# EAGLE schematic powermodule (EAGLE 9.6.2)
SCHEMATIC_VERSION: V6.2.2

## Sheet 1 of 11: SPI-Flash
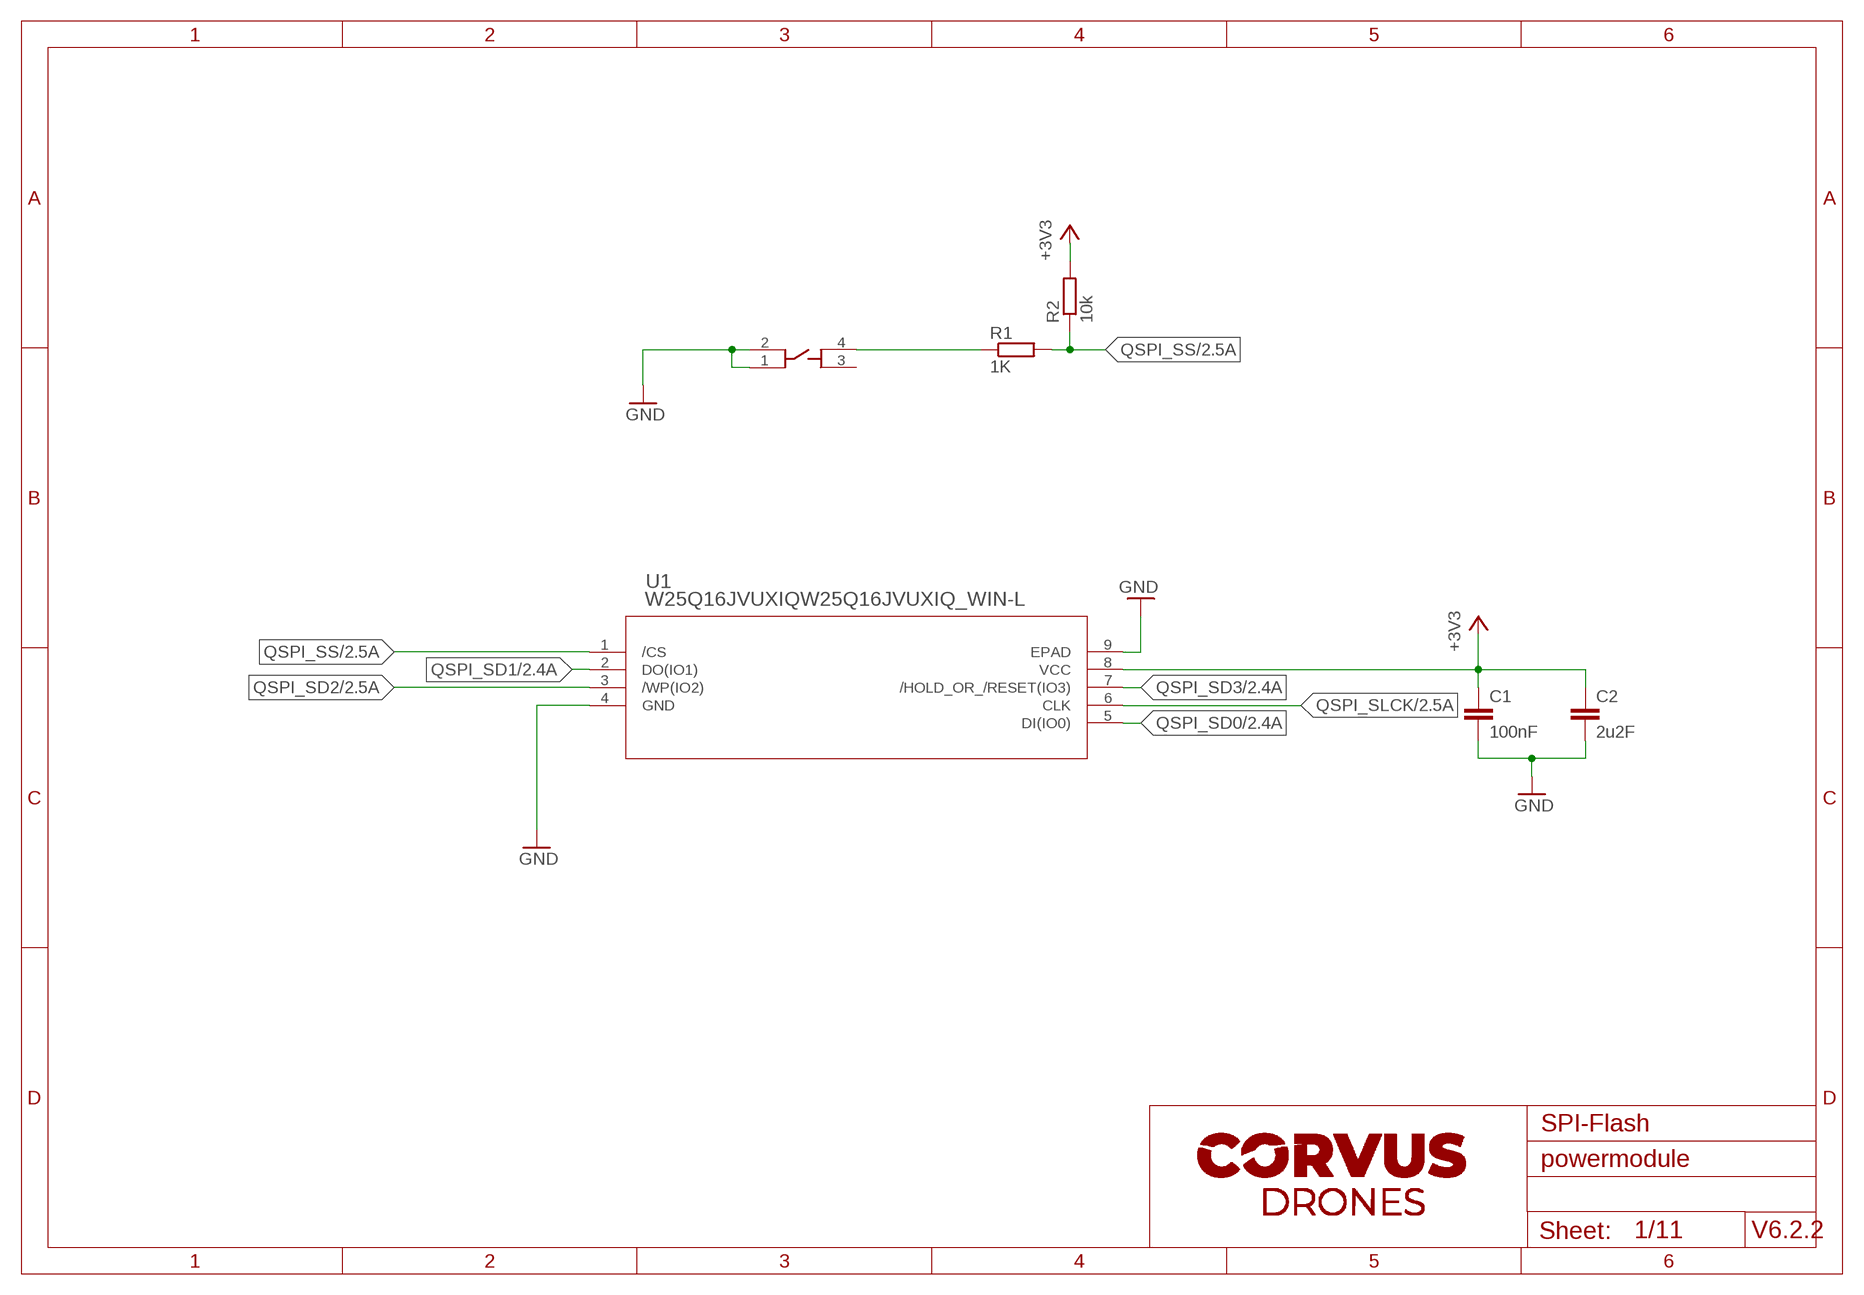
[diagram p0: schematic, sheet 1]

### Parts
C1  100nF  C_0603_100N  [C0603]
C2  2u2F  C_0603_2U2  [C0603]
R1  1K  R_0603_1K  [R0603]
R2  10k  R_0603_10K  [R0603]
SW1  BOOTSEL  EVQ-P7J01P  [EVQ-P7J01P]
U1  W25Q16JVUXIQW25Q16JVUXIQ_WIN-L  [W25Q16JVUXIQ_WIN-L]

### Nets
+3V3: C1.1 C2.1 R2.2 U1.8(VCC) ; also sheet 2,4,6,7,10
GND: C1.2 C2.2 SW1.1 SW1.2 U1.4(GND) U1.9(EPAD) ; also sheet 2,3,4,5,6,7,8,9,10,11
N$1: R1.1 SW1.4
QSPI_SD0: U1.5(DI(IO0)) ; also sheet 2
QSPI_SD1: U1.2(DO(IO1)) ; also sheet 2
QSPI_SD2: U1.3(/WP(IO2)) ; also sheet 2
QSPI_SD3: U1.7(/HOLD_OR_/RESET(IO3)) ; also sheet 2
QSPI_SLCK: U1.6(CLK) ; also sheet 2
QSPI_SS: R1.2 R2.1 U1.1(/CS) ; also sheet 2
Unconnected: SW1.3

## Sheet 2 of 11: RP2040 mCU part
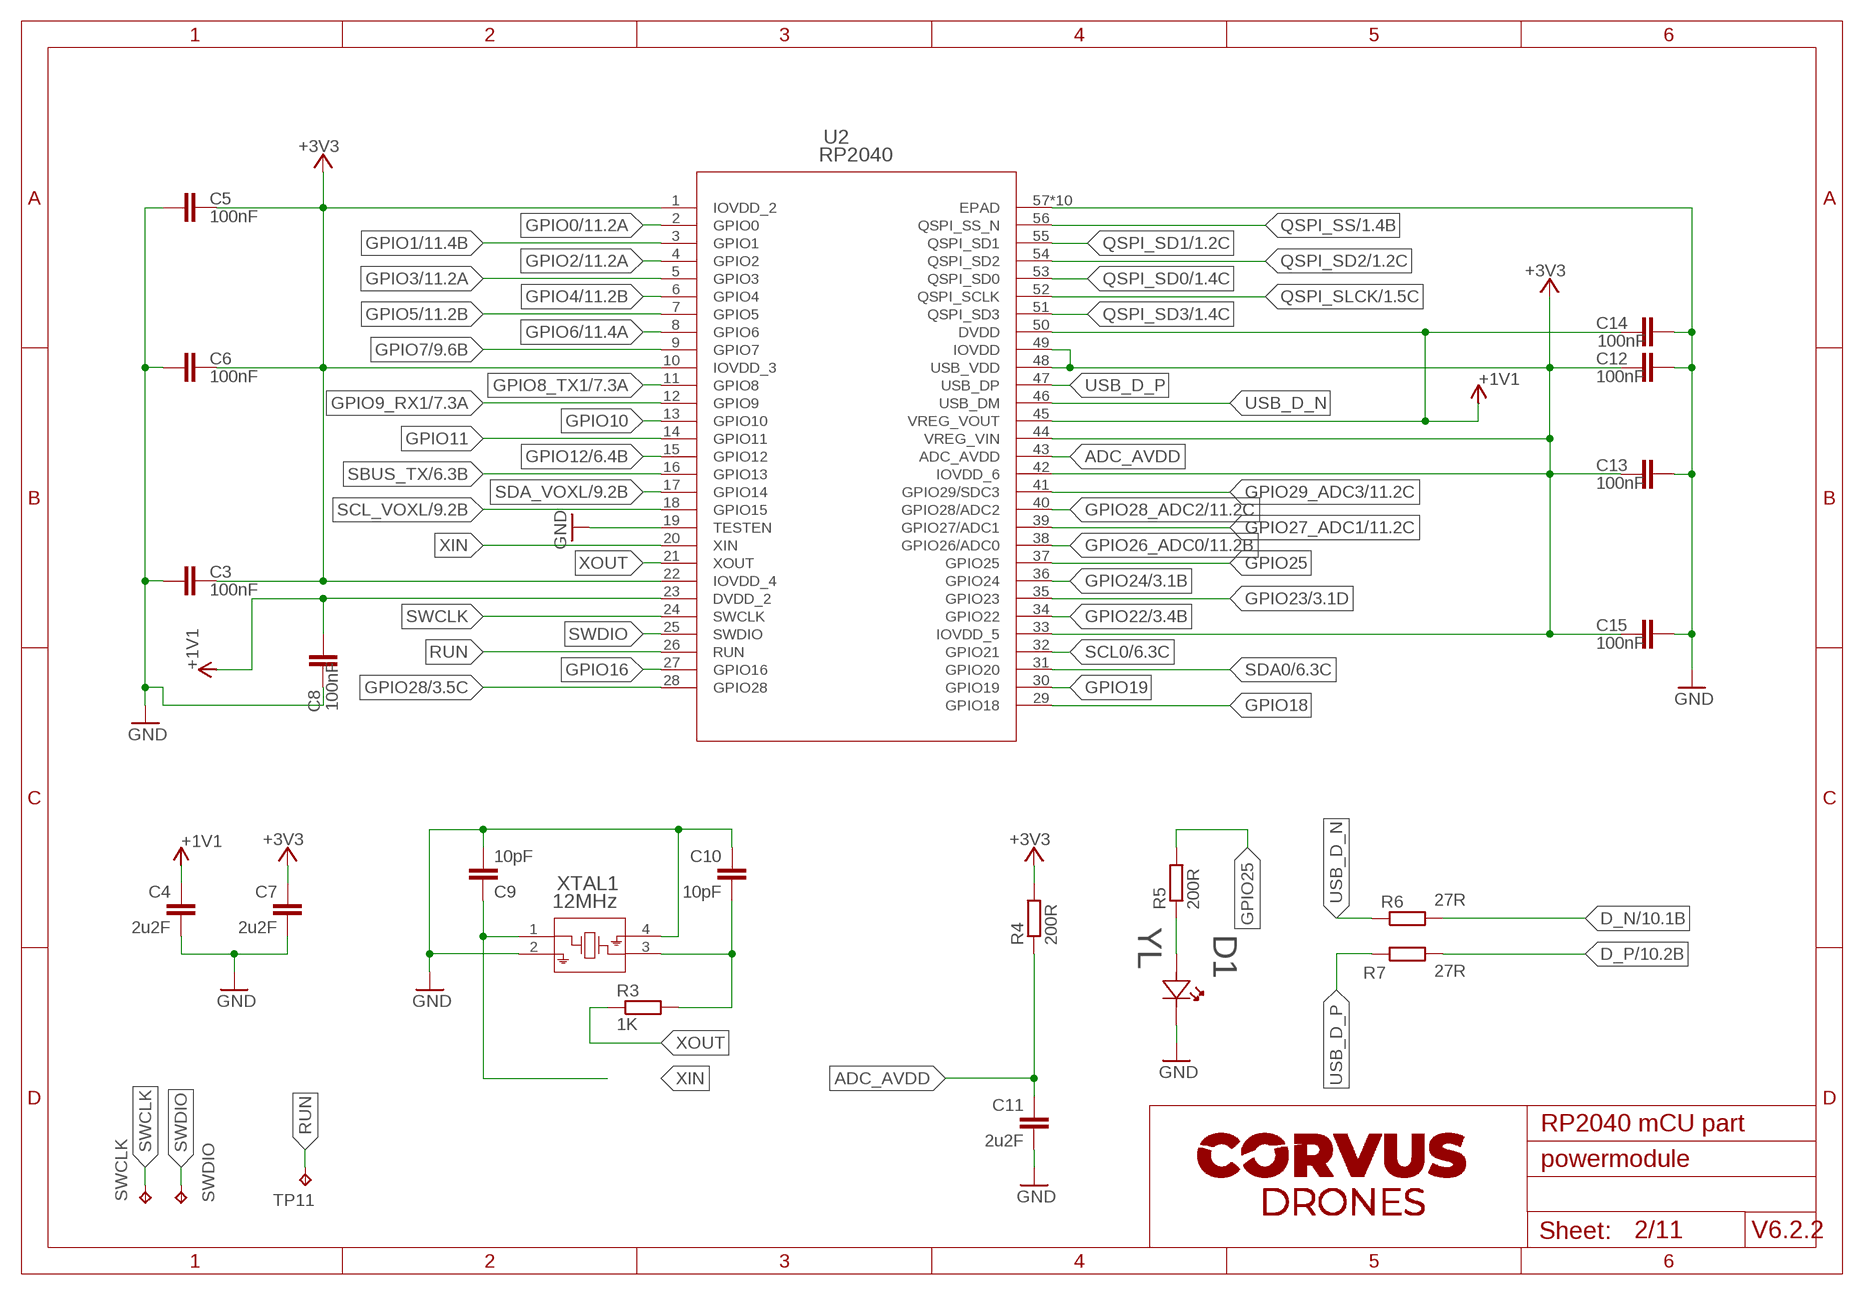
[diagram p1: schematic, sheet 2]

### Parts
C3  100nF  C_0603_100N  [C0603]
C4  2u2F  C_0603_2U2  [C0603]
C5  100nF  C_0603_100N  [C0603]
C6  100nF  C_0603_100N  [C0603]
C7  2u2F  C_0603_2U2  [C0603]
C8  100nF  C_0603_100N  [C0603]
C9  10pF  C_0603_10P  [C0603]
C10  10pF  C_0603_10P  [C0603]
C11  2u2F  C_0603_2U2  [C0603]
C12  100nF  C_0603_100N  [C0603]
C13  100nF  C_0603_100N  [C0603]
C14  100nF  C_0603_100N  [C0603]
C15  100nF  C_0603_100N  [C0603]
D1  YL  LED_0805_YELLOW  [LED_0805]
R3  1K  R_0603_1K  [R0603]
R4  200R  R_0603_200R  [R0603]
R5  200R  R_0603_200R  [R0603]
R6  27R  R_0603_27R  [R0603]
R7  27R  R_0603_27R  [R0603]
SWCLK  TPTP11R  [TP11R]
SWDIO  TPTP11R  [TP11R]
TP11  TPTP11R  [TP11R]
U2  RP2040  RP2040TR7_RPI-L  [RP2040TR7_RPI-L]
XTAL1  12MHz  MCSJK-7U-12.00-10-10-80-B-10_12MHZSMD3225_3.2X2.5X0.7_MTC-L  [SMD3225_3.2X2.5X0.7_MTC-L]

### Nets
+1V1: C4.2 C8.1 C14.2 U2.23(DVDD_2) U2.45(VREG_VOUT) U2.50(DVDD) ; supply symbol labelled 1V1
+3V3: C3.2 C5.1 C6.1 C7.2 C12.1 C13.1 C15.2 R4.2 U2.1(IOVDD_2) U2.10(IOVDD_3) U2.22(IOVDD_4) U2.33(IOVDD_5) U2.42(IOVDD_6) U2.44(VREG_VIN) U2.48(USB_VDD) U2.49(IOVDD) ; also sheet 1,4,6,7,10
ADC_AVDD: C11.2 R4.1 U2.43(ADC_AVDD)
D_N [dif pairs]: R6.2 ; also sheet 10
D_P [dif pairs]: R7.2 ; also sheet 10
GND: C3.1 C4.1 C5.2 C6.2 C7.1 C8.2 C9.1 C10.2 C11.1 C12.2 C13.2 C14.1 C15.1 D1.C U2.19(TESTEN) U2.57(EPAD) U2.58(EPAD) U2.59(EPAD) U2.60(EPAD) U2.61(EPAD) U2.62(EPAD) U2.63(EPAD) U2.64(EPAD) U2.65(EPAD) U2.66(EPAD) XTAL1.2 XTAL1.4 ; also sheet 1,3,4,5,6,7,8,9,10,11
GPIO0: U2.2(GPIO0) ; also sheet 11
GPIO1: U2.3(GPIO1) ; also sheet 11
GPIO2: U2.4(GPIO2) ; also sheet 11
GPIO3: U2.5(GPIO3) ; also sheet 11
GPIO4: U2.6(GPIO4) ; also sheet 11
GPIO5: U2.7(GPIO5) ; also sheet 11
GPIO6: U2.8(GPIO6) ; also sheet 11
GPIO7: U2.9(GPIO7) ; also sheet 9
GPIO8_TX1: U2.11(GPIO8) ; also sheet 7
GPIO9_RX1: U2.12(GPIO9) ; also sheet 7
GPIO10: U2.13(GPIO10)
GPIO11: U2.14(GPIO11)
GPIO12: U2.15(GPIO12) ; also sheet 6
GPIO16: U2.27(GPIO16)
GPIO18: U2.29(GPIO18)
GPIO19: U2.30(GPIO19)
GPIO22: U2.34(GPIO22) ; also sheet 3
GPIO23: U2.35(GPIO23) ; also sheet 3
GPIO24: U2.36(GPIO24) ; also sheet 3
GPIO25: R5.2 U2.37(GPIO25)
GPIO26_ADC0: U2.38(GPIO26/ADC0) ; also sheet 11
GPIO27_ADC1: U2.39(GPIO27/ADC1) ; also sheet 11
GPIO28: U2.28(GPIO28) ; also sheet 3
GPIO28_ADC2: U2.40(GPIO28/ADC2) ; also sheet 11
GPIO29_ADC3: U2.41(GPIO29/SDC3) ; also sheet 11
N$10: C10.1 R3.2 XTAL1.3
N$24: D1.A R5.1
QSPI_SD0: U2.53(QSPI_SD0) ; also sheet 1
QSPI_SD1: U2.55(QSPI_SD1) ; also sheet 1
QSPI_SD2: U2.54(QSPI_SD2) ; also sheet 1
QSPI_SD3: U2.51(QSPI_SD3) ; also sheet 1
QSPI_SLCK: U2.52(QSPI_SCLK) ; also sheet 1
QSPI_SS: U2.56(QSPI_SS_N) ; also sheet 1
RUN: TP11.TP U2.26(RUN)
SBUS_TX: U2.16(GPIO13) ; also sheet 6
SCL0: U2.32(GPIO21) ; also sheet 6
SCL_VOXL: U2.18(GPIO15) ; also sheet 9
SDA0: U2.31(GPIO20) ; also sheet 6
SDA_VOXL: U2.17(GPIO14) ; also sheet 9
SWCLK: SWCLK.TP U2.24(SWCLK)
SWDIO: SWDIO.TP U2.25(SWDIO)
USB_D_N [dif pairs]: R6.1 U2.46(USB_DM)
USB_D_P [dif pairs]: R7.1 U2.47(USB_DP)
XIN: C9.2 U2.20(XIN) XTAL1.1
XOUT: R3.1 U2.21(XOUT)

## Sheet 3 of 11: Buck activators
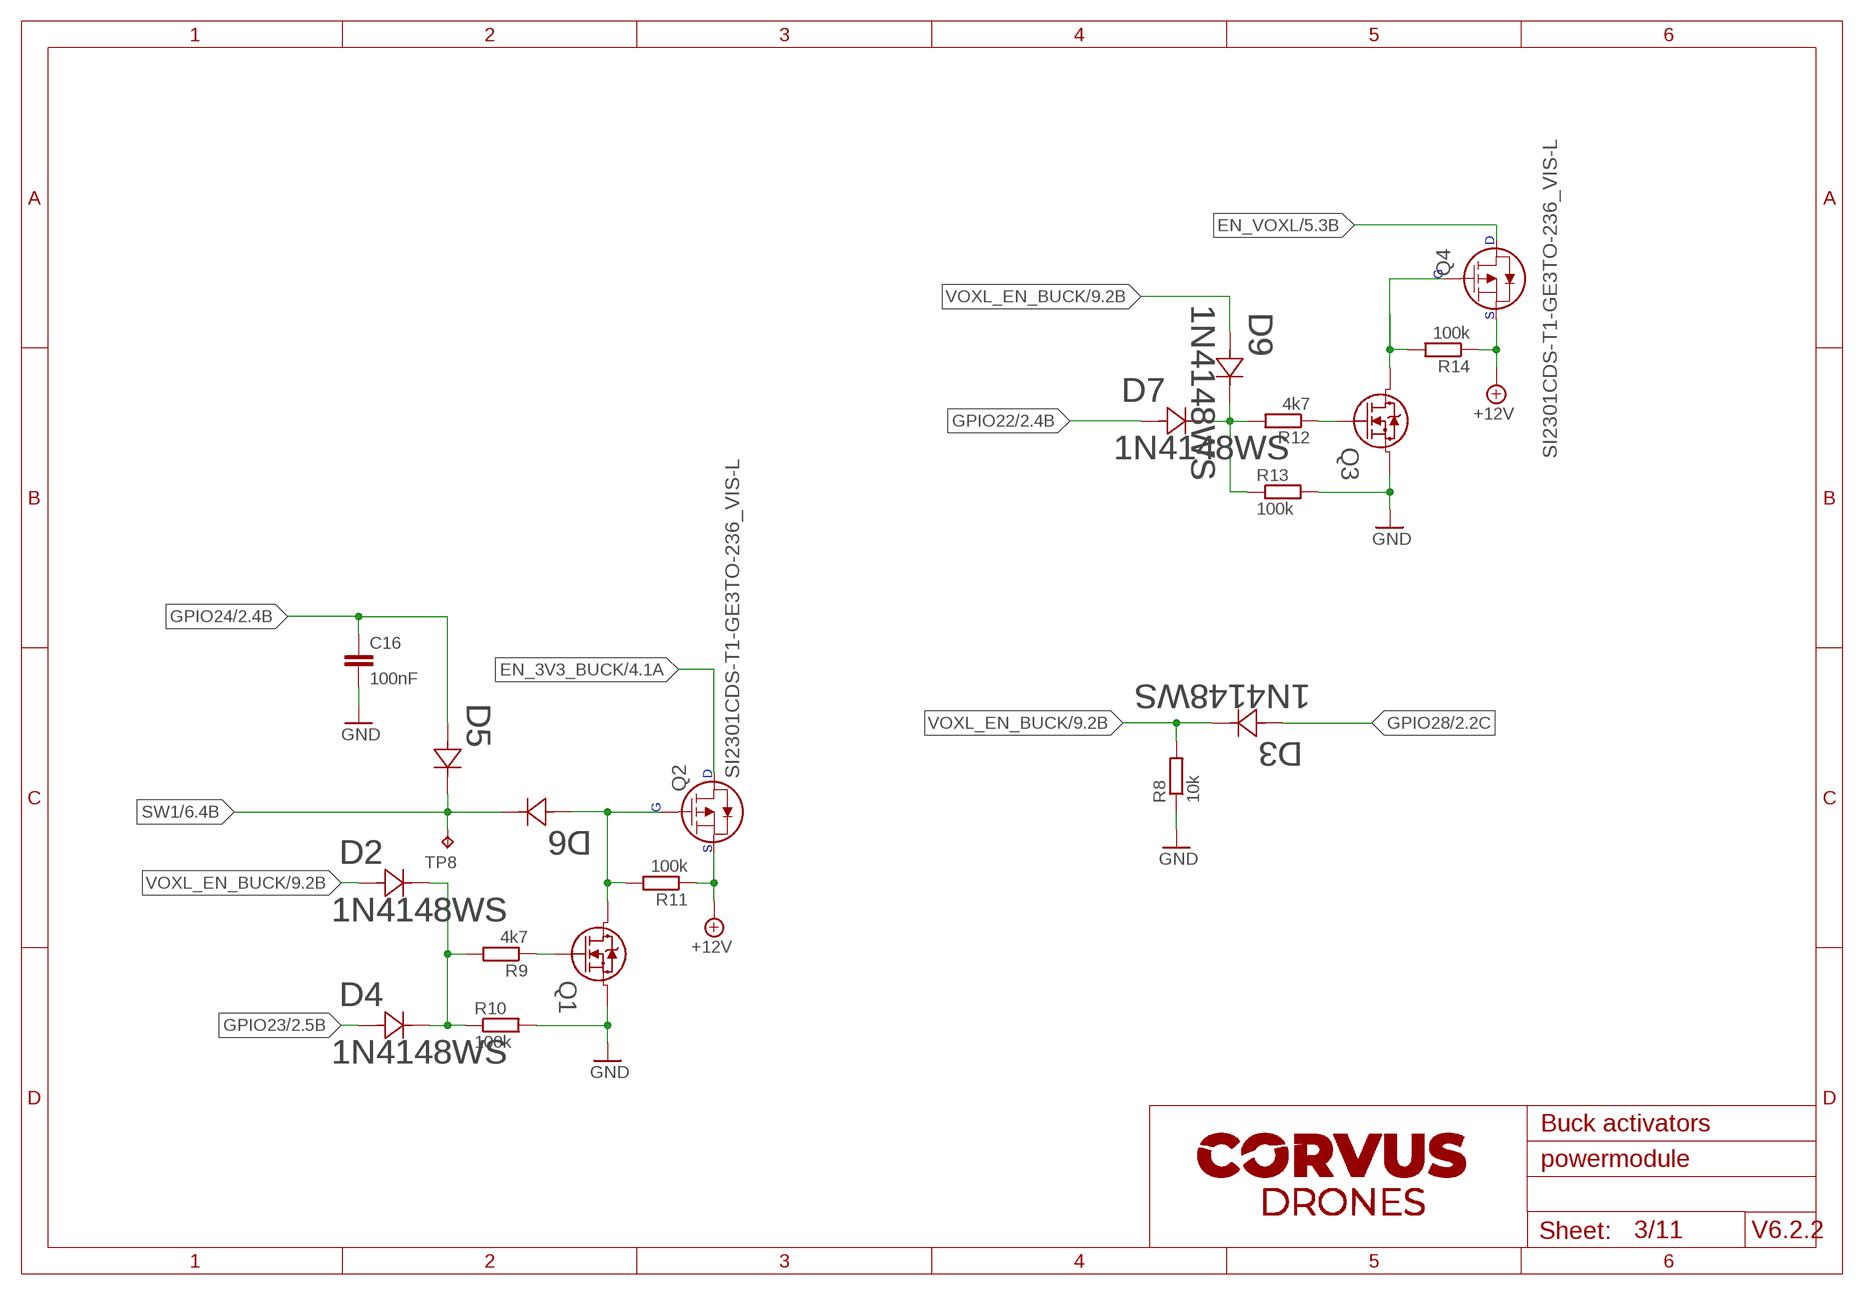
[diagram p2: schematic, sheet 3]

### Parts
C16  100nF  C_0603_100N  [C0603]
D2  1N4148WS  [SOD323_NEX-L]
D3  1N4148WS  [SOD323_NEX-L]
D4  1N4148WS  [SOD323_NEX-L]
D5  MMSD4148T1GSOD-123_ONS-L  [SOD-123_ONS-L]
D6  MMSD4148T1GSOD-123_ONS-L  [SOD-123_ONS-L]
D7  1N4148WS  [SOD323_NEX-L]
D9  1N4148WS  [SOD323_NEX-L]
Q1  2N7002,215TO-236AB_NEX-L  [TO-236AB_NEX-L]
Q2  SI2301CDS-T1-GE3TO-236_VIS-L  [TO-236_VIS-L]
Q3  2N7002,215TO-236AB_NEX-L  [TO-236AB_NEX-L]
Q4  SI2301CDS-T1-GE3TO-236_VIS-L  [TO-236_VIS-L]
R8  10k  R_0603_10K  [R0603]
R9  4k7  R_0603_4K7  [R0603]
R10  100k  R_0603_100K  [R0603]
R11  100k  R_0603_100K  [R0603]
R12  4k7  R_0603_4K7  [R0603]
R13  100k  R_0603_100K  [R0603]
R14  100k  R_0603_100K  [R0603]
TP8  TPTP11R  [TP11R]

### Nets
+12V: Q2.2(S) Q4.2(S) R11.1 R14.1 ; also sheet 4,5,6
EN_3V3_BUCK: Q2.3(D) ; also sheet 4
EN_VOXL: Q4.3(D) ; also sheet 5
GND: C16.2 Q1.2 Q3.2 R8.1 R10.2 R13.2 ; also sheet 1,2,4,5,6,7,8,9,10,11
GPIO22: D7.2 ; also sheet 2
GPIO23: D4.2 ; also sheet 2
GPIO24: C16.1 D5.2 ; also sheet 2
GPIO28: D3.2 ; also sheet 2
N$21: D7.1 D9.1 R12.2 R13.1
N$25: D6.2 Q1.3 Q2.1(G) R11.2
N$27: Q1.1 R9.1
N$29: Q3.3 Q4.1(G) R14.2
N$30: D2.1 D4.1 R9.2 R10.1
N$31: Q3.1 R12.1
SW1: D5.1 D6.1 TP8.TP ; also sheet 6
VOXL_EN_BUCK: D2.2 D3.1 D9.2 R8.2 ; also sheet 9

## Sheet 4 of 11: 3V3 & 5V buck
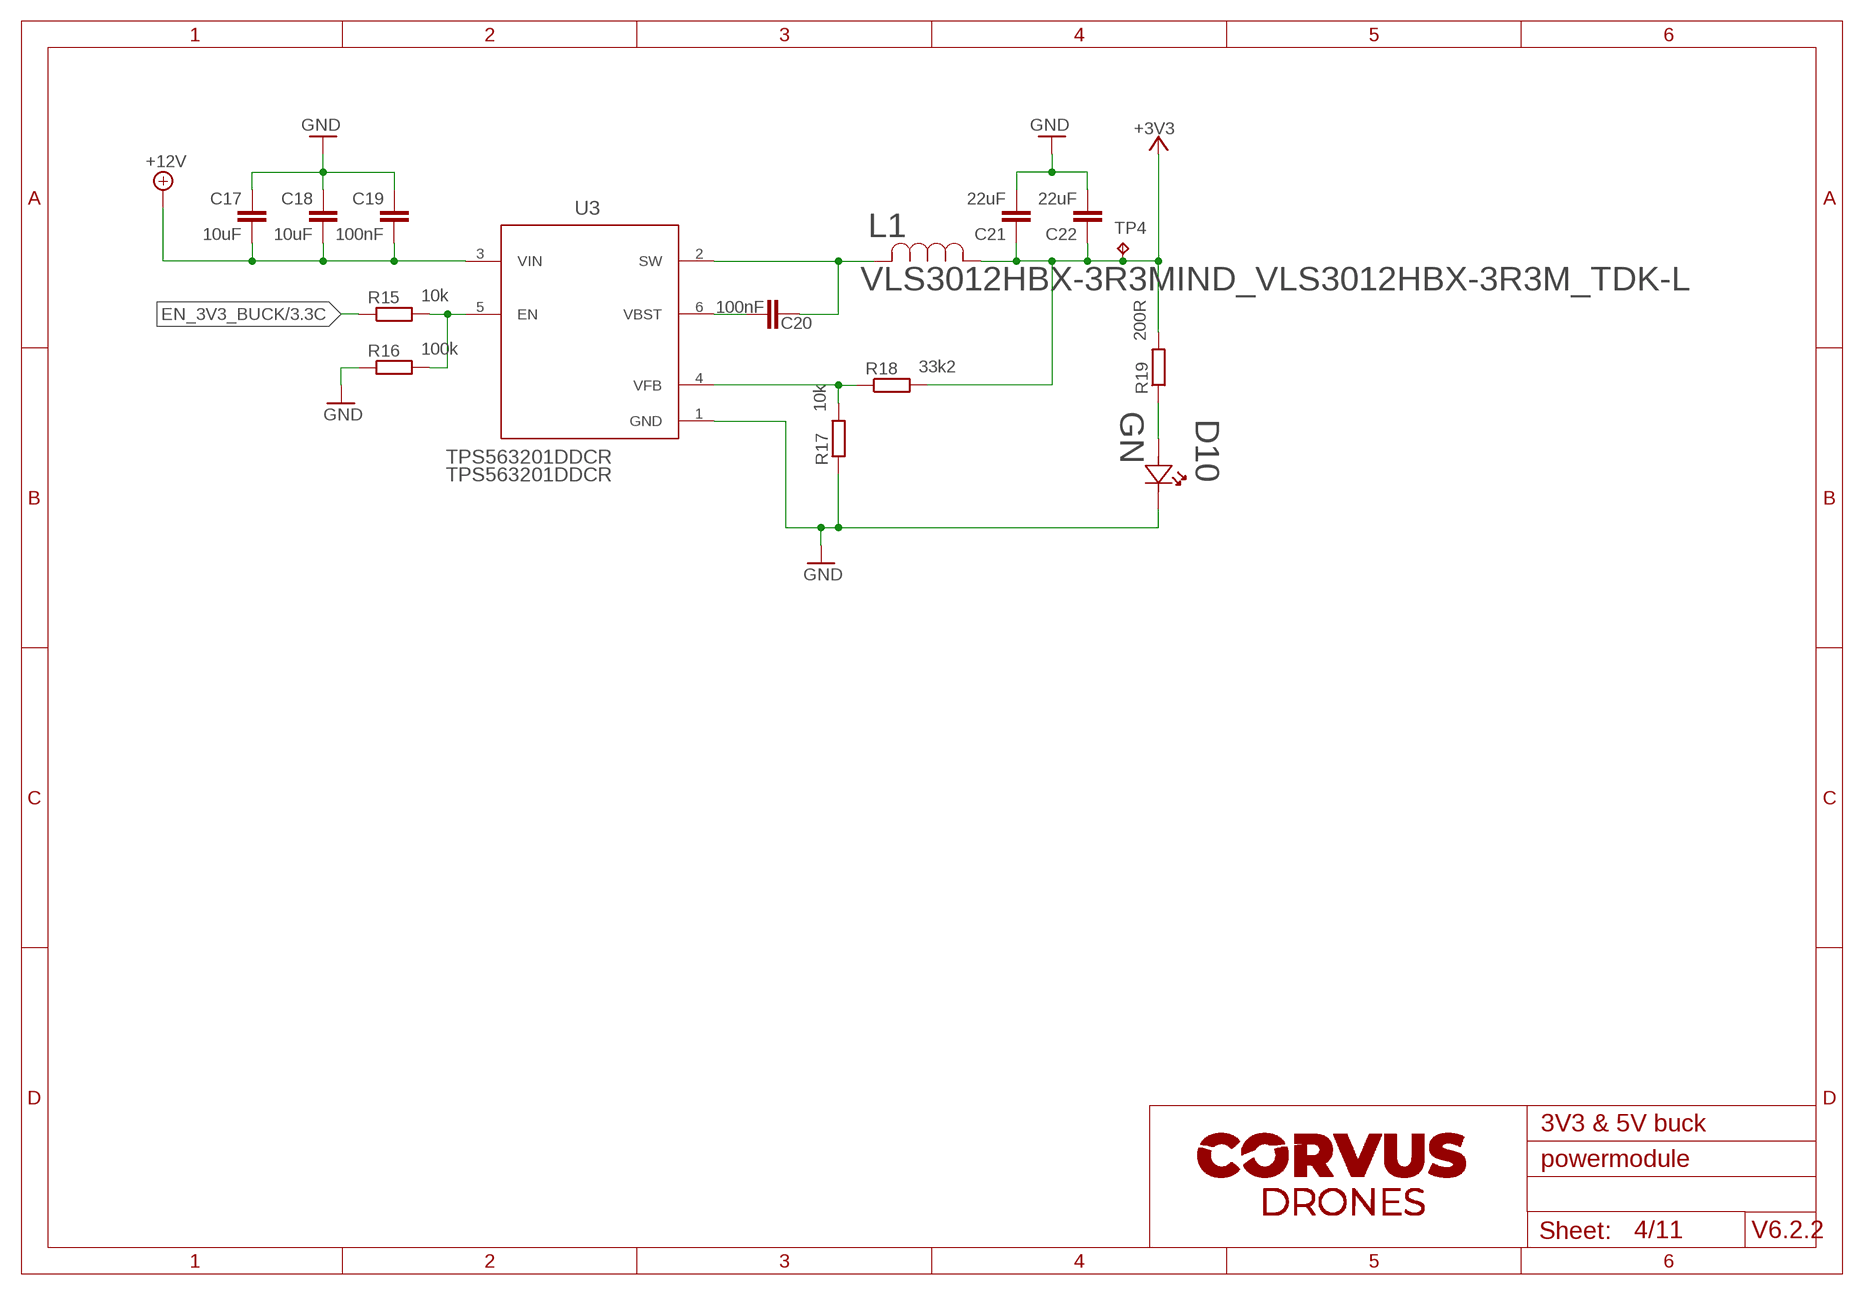
[diagram p3: schematic, sheet 4]

### Parts
C17  10uF  C_0603_10U  [C0603]
C18  10uF  C_0603_10U  [C0603]
C19  100nF  C_0603_100N  [C0603]
C20  100nF  C_0603_100N  [C0603]
C21  22uF  C_1206_22U  [C1206]
C22  22uF  C_1206_22U  [C1206]
D10  GN  LED_0805_GREEN  [LED_0805]
L1  VLS3012HBX-3R3MIND_VLS3012HBX-3R3M_TDK-L  [IND_VLS3012HBX-3R3M_TDK-L]
R15  10k  R_0603_10K  [R0603]
R16  100k  R_0603_100K  [R0603]
R17  10k  R_0603_10K  [R0603]
R18  33k2  R_0603_33K2  [R0603]
R19  200R  R_0603_200R  [R0603]
TP4  TPTP11R  [TP11R]
U3  TPS563201DDCR  [DDC0006A_L]

### Nets
+3V3: C21.1 C22.1 L1.1 R18.2 R19.2 TP4.TP ; also sheet 1,2,6,7,10
+12V: C17.1 C18.1 C19.1 U3.3(VIN) ; also sheet 3,5,6
EN_3V3_BUCK: R15.1 ; also sheet 3
GND: C17.2 C18.2 C19.2 C21.2 C22.2 D10.C R16.1 R17.1 U3.1(GND) ; also sheet 1,2,3,5,6,7,8,9,10,11
N$4: R15.2 R16.2 U3.5(EN)
N$5: R17.2 R18.1 U3.4(VFB)
N$6: C20.1 U3.6(VBST)
N$8: C20.2 L1.2 U3.2(SW)
N$32: D10.A R19.1

## Sheet 5 of 11: Buckconveter voxl
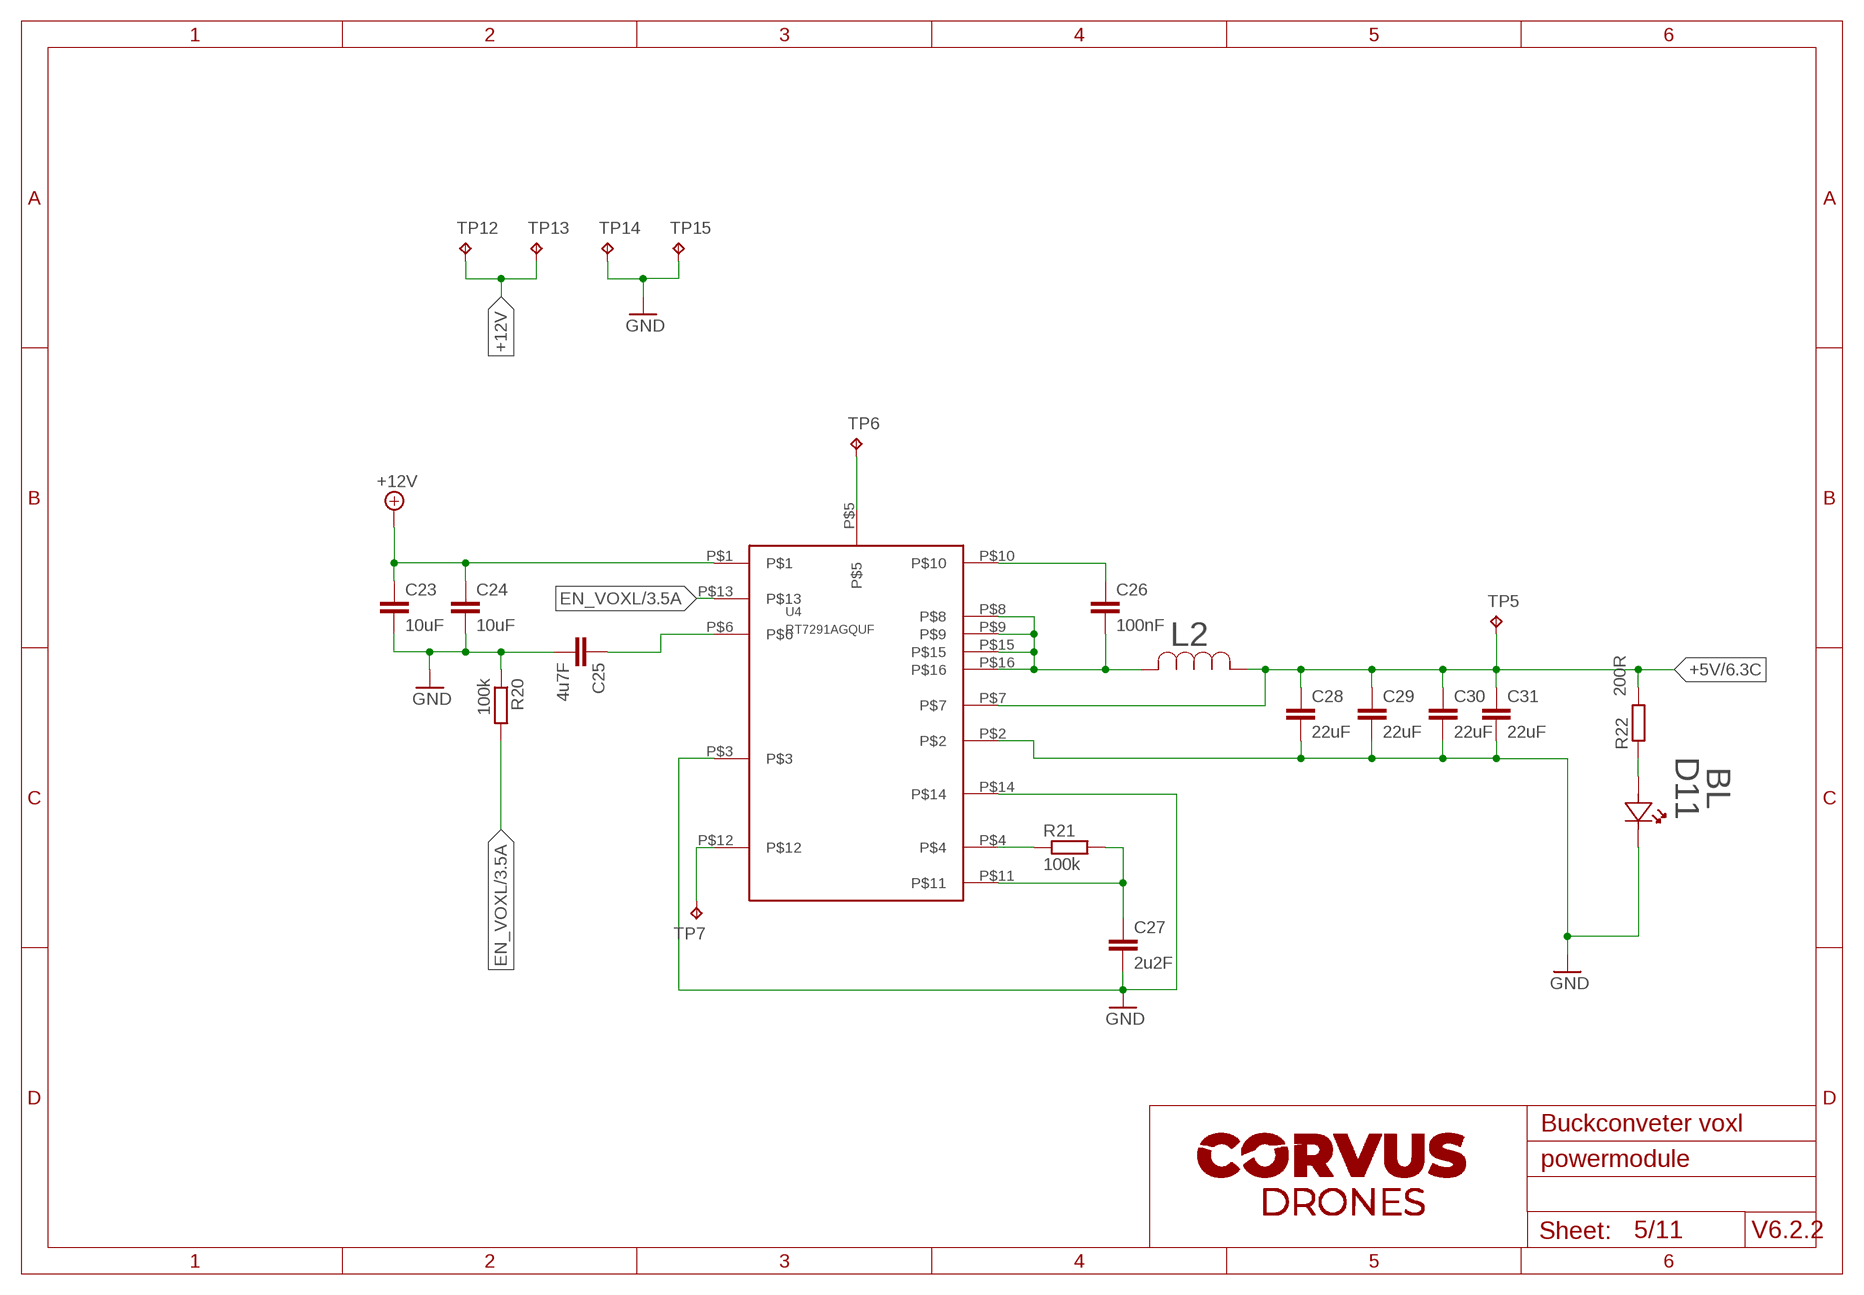
[diagram p4: schematic, sheet 5]

### Parts
C23  10uF  C_0805_10U  [C0805]
C24  10uF  C_0805_10U  [C0805]
C25  4u7F  C_0603_4U7  [C0603]
C26  100nF  C_0603_100N  [C0603]
C27  2u2F  C_0603_2U2  [C0603]
C28  22uF  C_1206_22U  [C1206]
C29  22uF  C_1206_22U  [C1206]
C30  22uF  C_1206_22U  [C1206]
C31  22uF  C_1206_22U  [C1206]
D11  BL  LED_0805_BLUE  [LED_0805]
L2  HA72L-06301R5LFTR  [HA72L-06301R5LFTR]
R20  100k  R_0603_100K  [R0603]
R21  100k  R_0603_100K  [R0603]
R22  200R  R_0603_200R  [R0603]
TP5  TPTP11R  [TP11R]
TP6  TPTP11R  [TP11R]
TP7  TPTP11R  [TP11R]
TP12  TPTP11R  [TP11R]
TP13  TPTP11R  [TP11R]
TP14  TPTP11R  [TP11R]
TP15  TPTP11R  [TP11R]
U4  RT7291AGQUF  [RT7291AGQUF]

### Nets
+5V: C28.1 C29.1 C30.1 C31.1 L2.P$1 R22.2 TP5.TP U4.P$7 ; also sheet 6,8
+12V: C23.1 C24.1 TP12.TP TP13.TP U4.P$1 ; also sheet 3,4,6
EN_VOXL: R20.2 U4.P$13 ; also sheet 3
GND: C23.2 C24.2 C25.2 C27.2 C28.2 C29.2 C30.2 C31.2 D11.C R20.1 TP14.TP TP15.TP U4.P$2 U4.P$3 U4.P$14 ; also sheet 1,2,3,4,6,7,8,9,10,11
N$2: C26.2 L2.P$2 U4.P$8 U4.P$9 U4.P$15 U4.P$16
N$3: C25.1 U4.P$6
N$11: C27.1 R21.2 U4.P$11
N$13: TP7.TP U4.P$12
N$14: R21.1 U4.P$4
N$15: D11.A R22.1
N$16: TP6.TP U4.P$5
N$19: C26.1 U4.P$10

## Sheet 6 of 11: connections
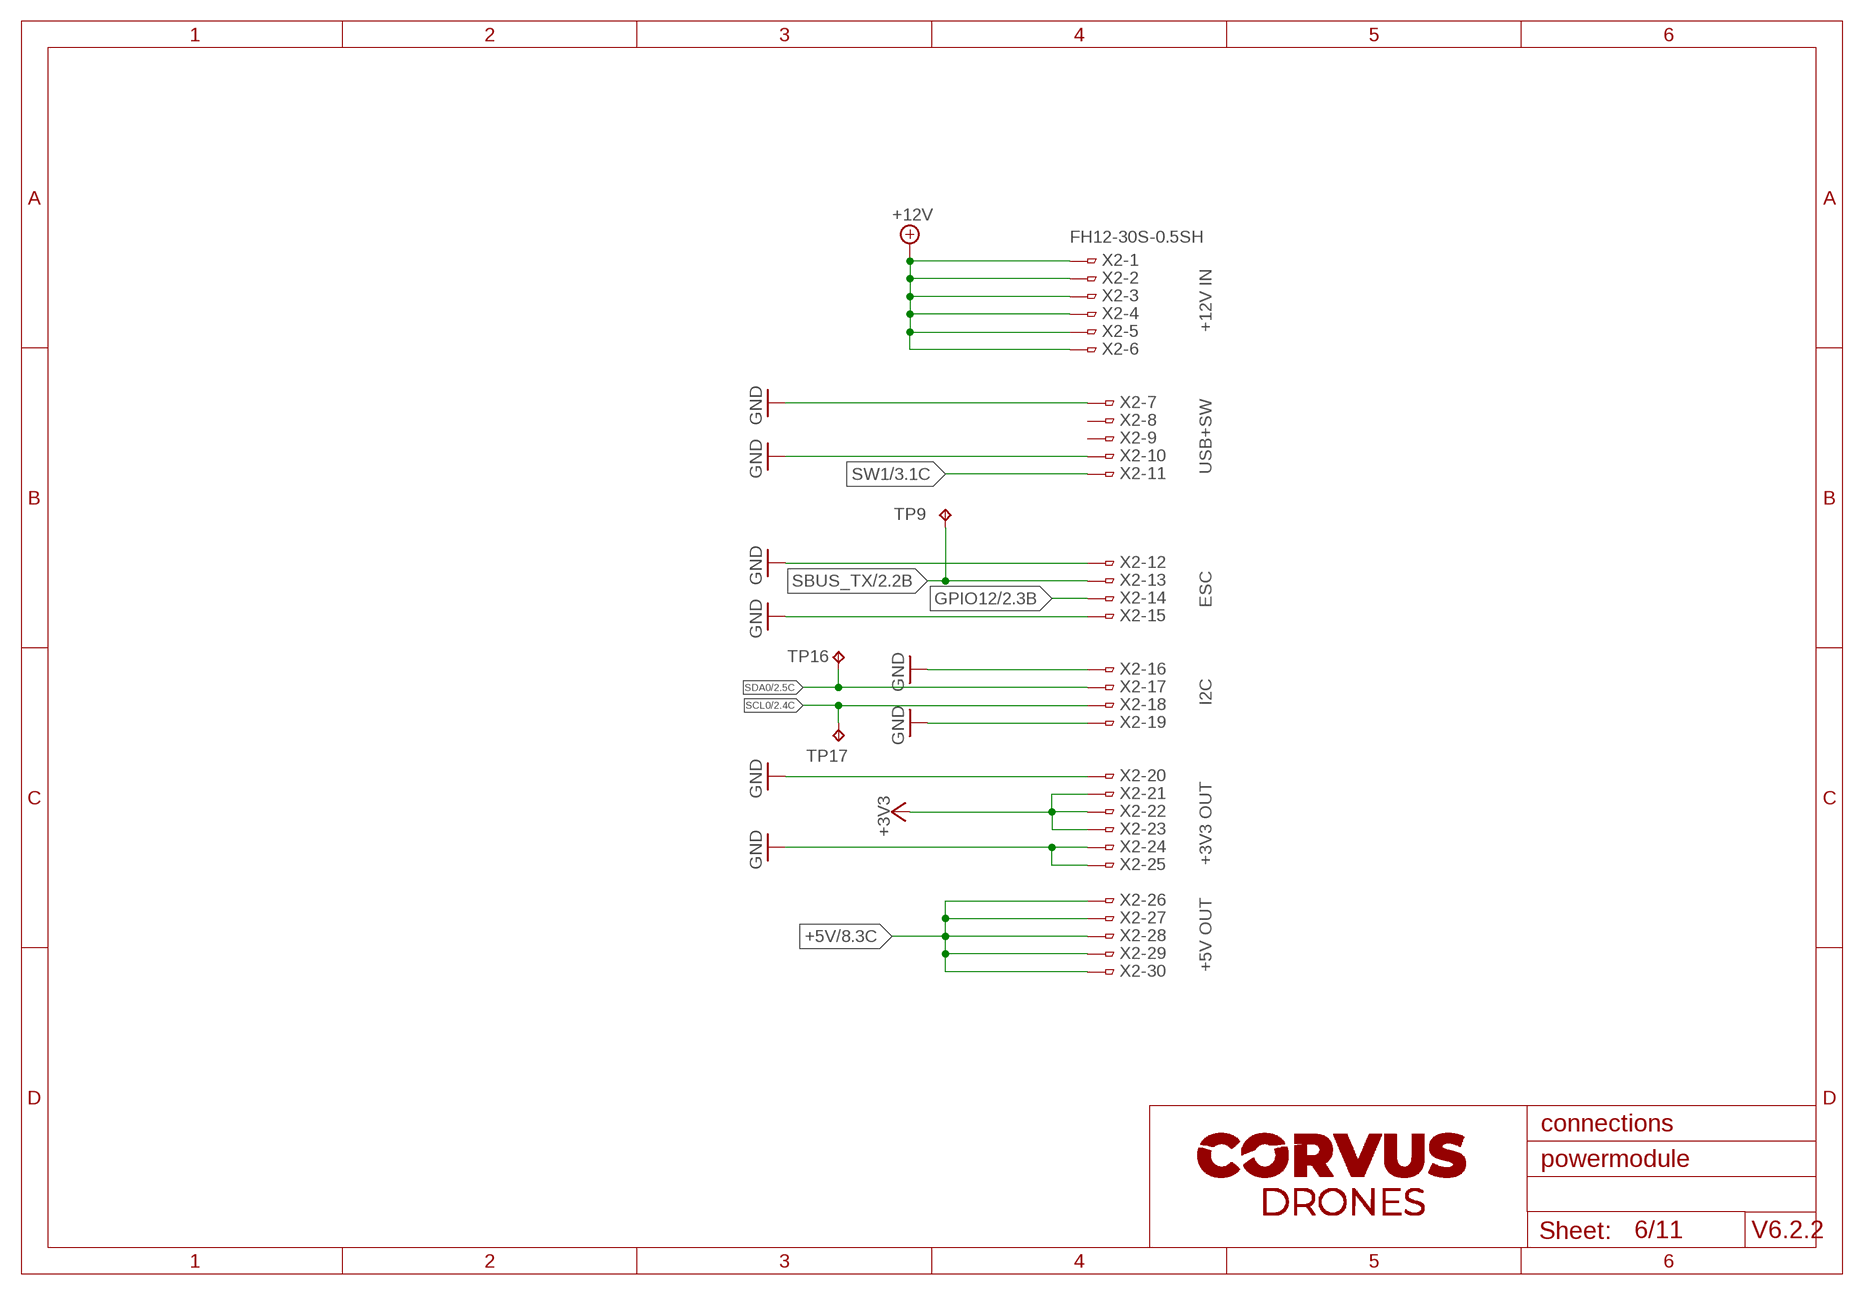
[diagram p5: schematic, sheet 6]

### Parts
TP9  TPTP11R  [TP11R]
TP16  TPTP11R  [TP11R]
TP17  TPTP11R  [TP11R]
X2  FH12-30S-0.5SH  [FH12-30S-0.5SH]

### Nets
+3V3: X2.21 X2.22 X2.23 ; also sheet 1,2,4,7,10
+5V: X2.26 X2.27 X2.28 X2.29 X2.30 ; also sheet 5,8
+12V: X2.1 X2.2 X2.3 X2.4 X2.5 X2.6 ; also sheet 3,4,5
GND: X2.7 X2.10 X2.12 X2.15 X2.16 X2.19 X2.20 X2.24 X2.25 ; also sheet 1,2,3,4,5,7,8,9,10,11
GPIO12: X2.14 ; also sheet 2
SBUS_TX: TP9.TP X2.13 ; also sheet 2
SCL0: TP17.TP X2.18 ; also sheet 2
SDA0: TP16.TP X2.17 ; also sheet 2
SW1: X2.11 ; also sheet 3
Unconnected: X2.8 X2.9

### Notes on the sheet
- +12V IN
- USB+SW
- ESC
- I2C
- +3V3 OUT
- +5V OUT

## Sheet 7 of 11: WiFi
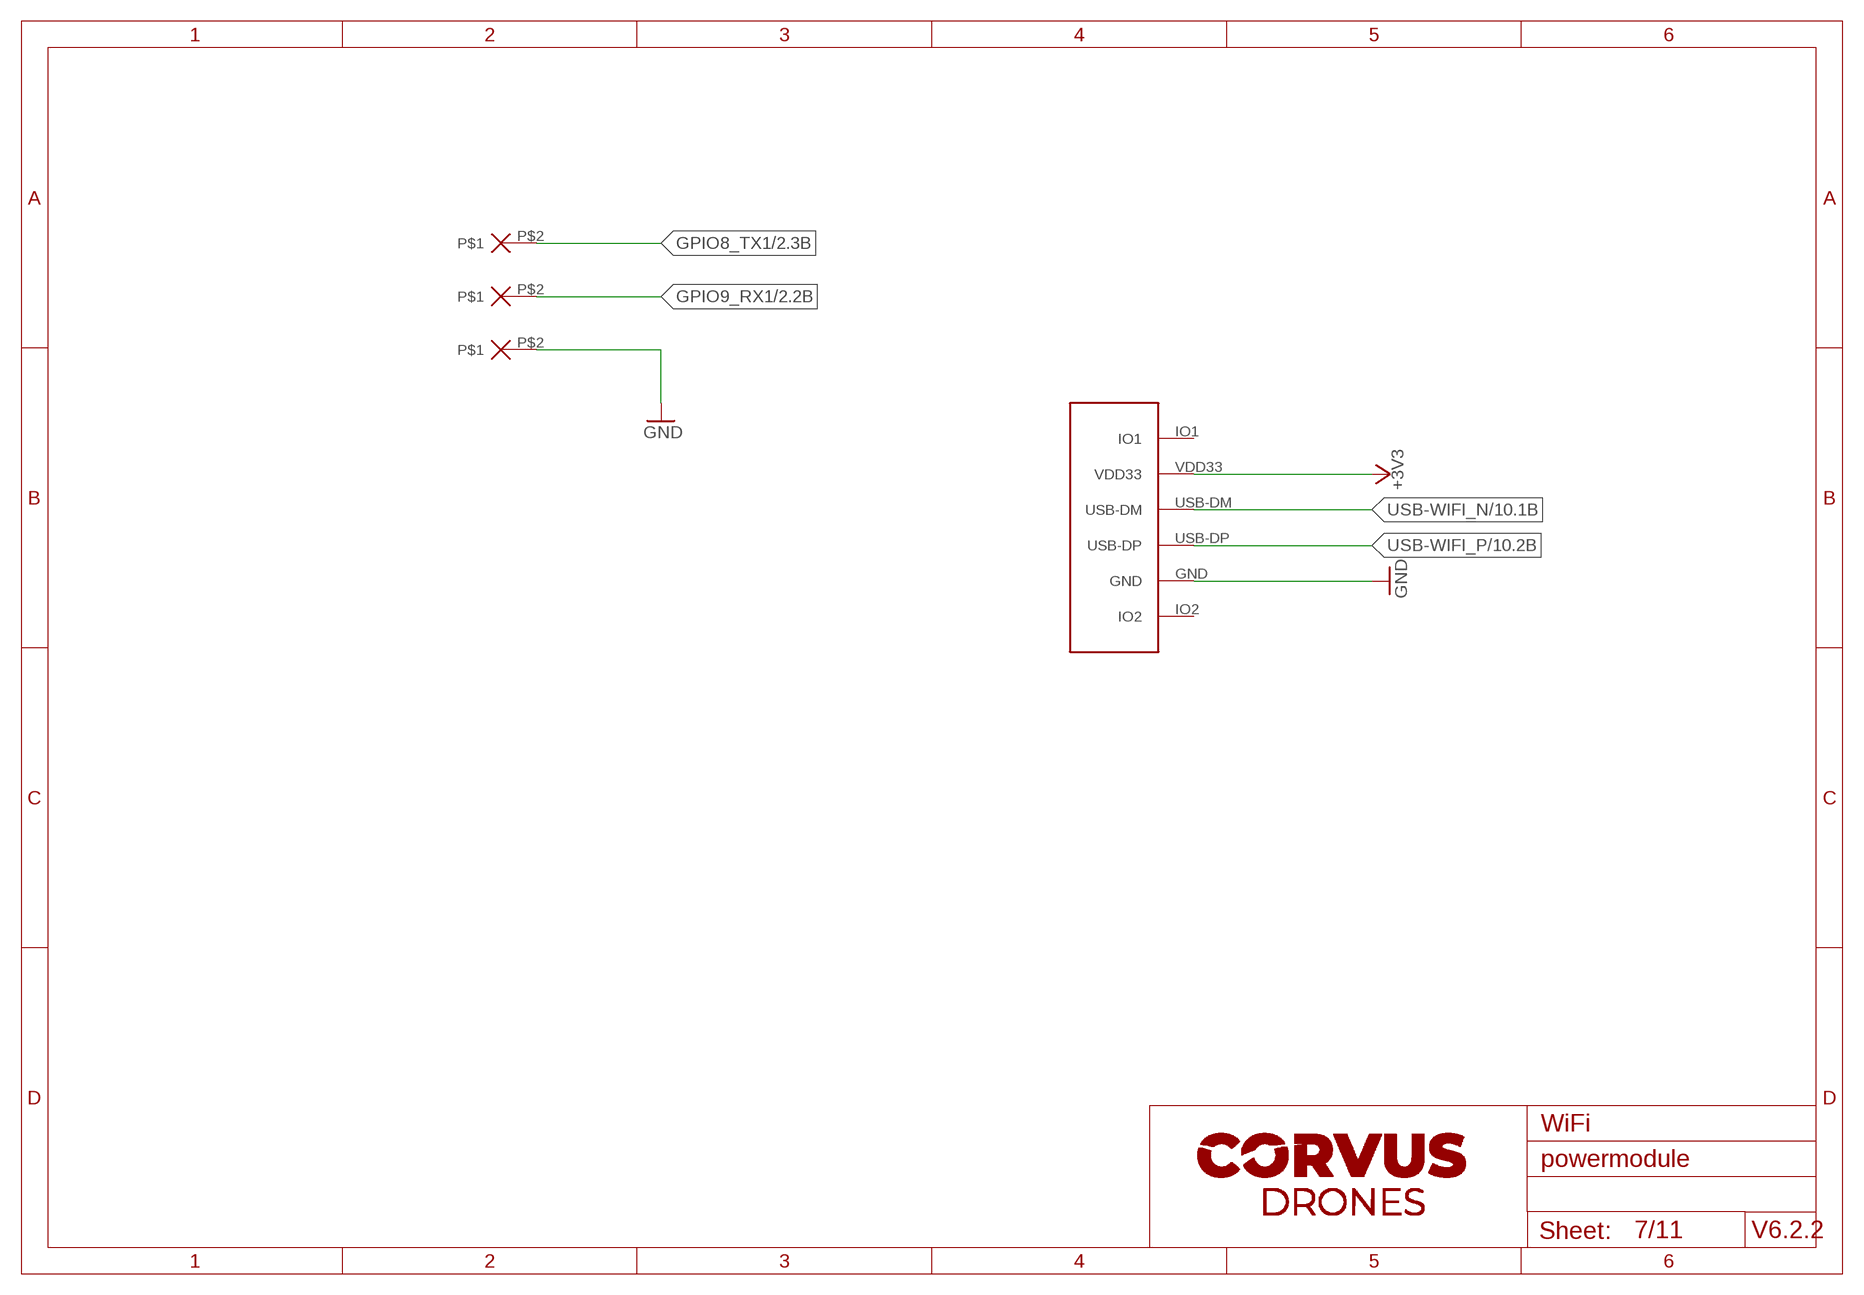
[diagram p6: schematic, sheet 7]

### Parts
GND_SER  TH-0.75/0.6  [TH-0.75/0.6]
W1  WIFI-RTL8188EUS  [WIFI-RTL8188EUS]
X3  TH-0.75/0.6  [TH-0.75/0.6]
X4  TH-0.75/0.6  [TH-0.75/0.6]

### Nets
+3V3: W1.VDD33 ; also sheet 1,2,4,6,10
GND: GND_SER.P$2 W1.GND ; also sheet 1,2,3,4,5,6,8,9,10,11
GPIO8_TX1: X3.P$2 ; also sheet 2
GPIO9_RX1: X4.P$2 ; also sheet 2
USB-WIFI_N: W1.USB-DM ; also sheet 10
USB-WIFI_P: W1.USB-DP ; also sheet 10
Unconnected: W1.IO1 W1.IO2

## Sheet 8 of 11: Voxl2 connection [J5]
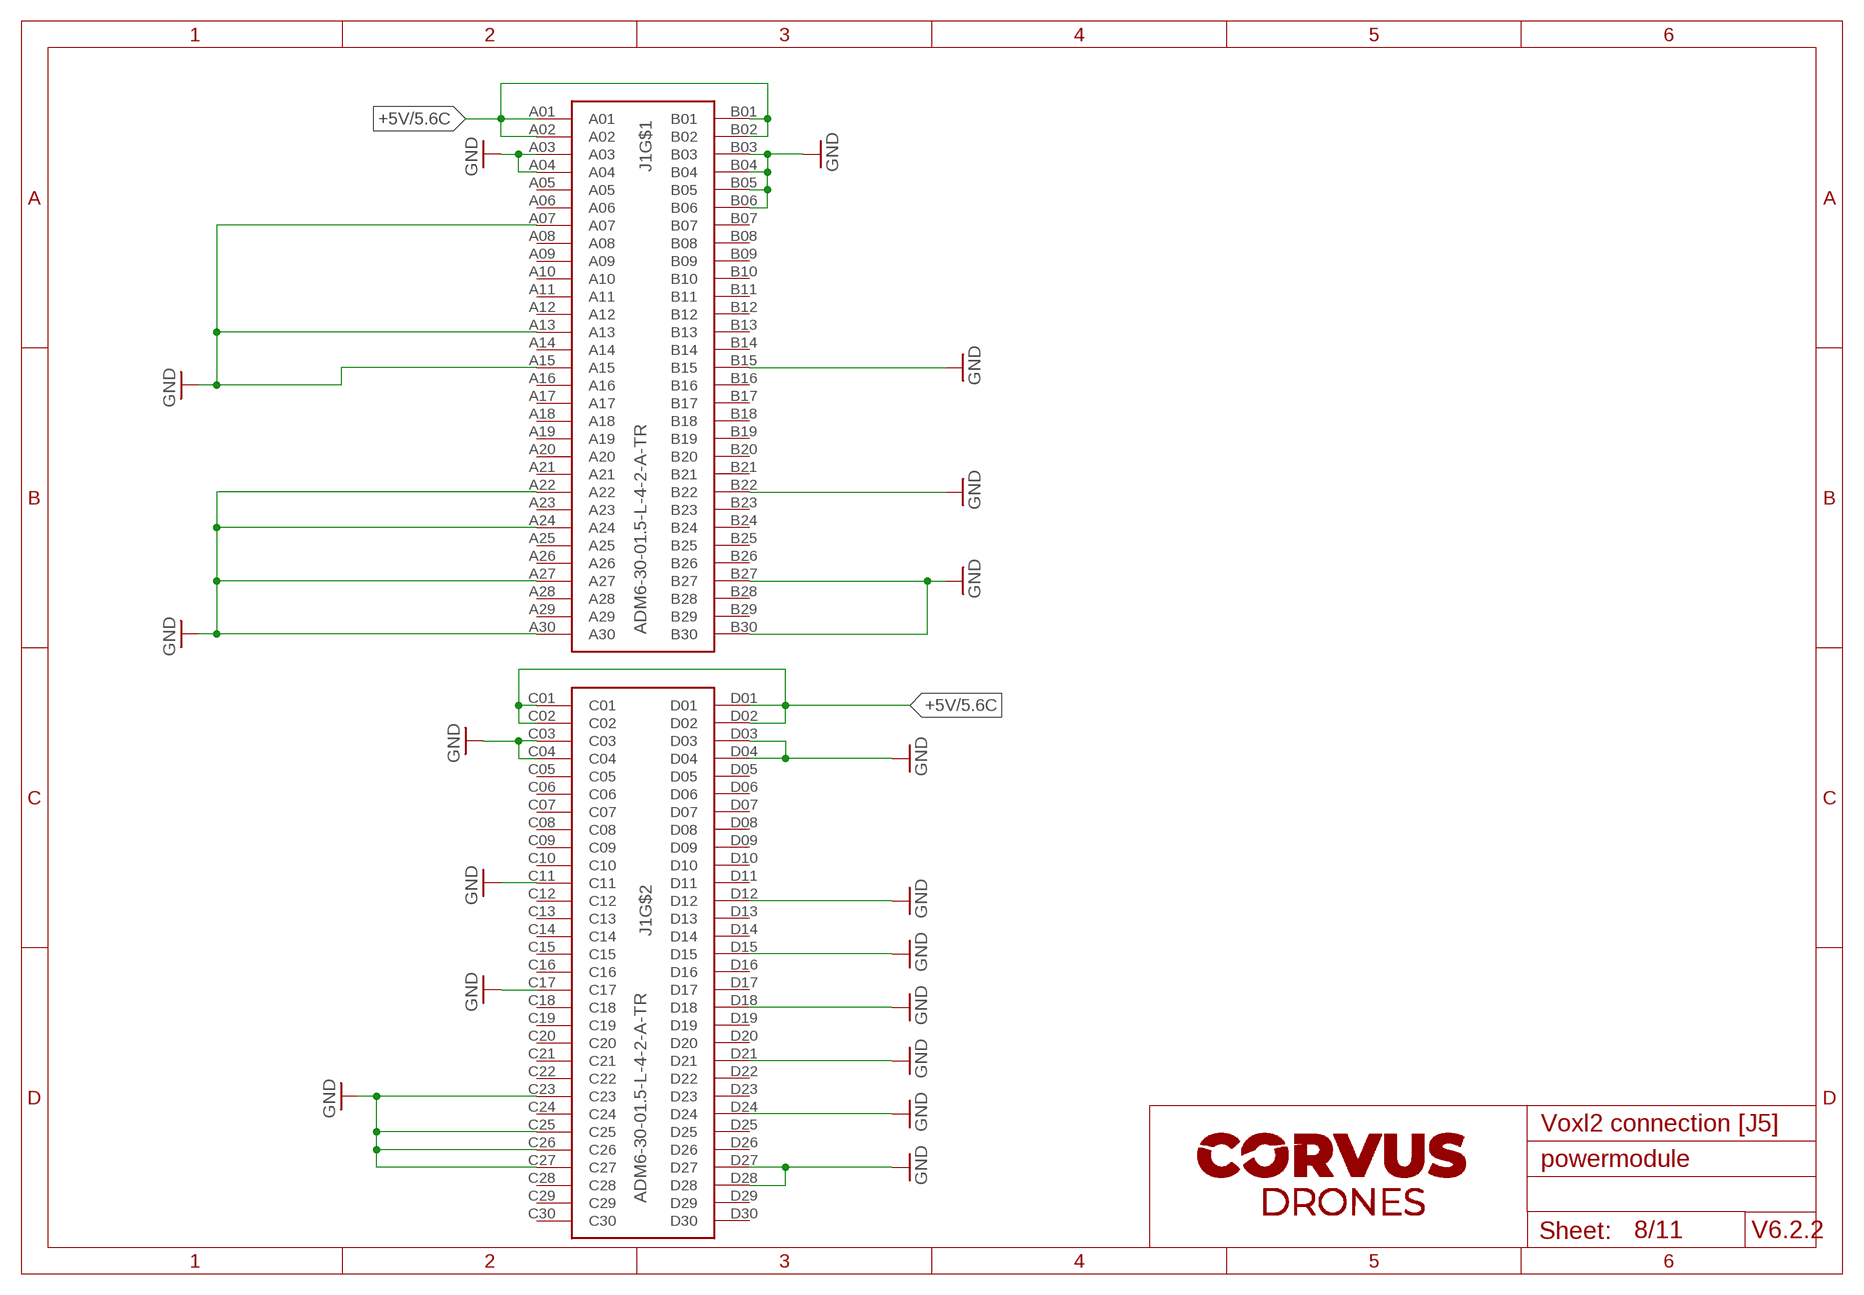
[diagram p7: schematic, sheet 8]

### Parts
J1  ADM6-30-01.5-L-4-2-A-TR  [SAMTEC_ADM6-30-01.5-L-4-2-A-TR]

### Nets
+5V: J1.A01 J1.A02 J1.B01 J1.B02 J1.C01 J1.C02 J1.D01 J1.D02 ; also sheet 5,6
GND: J1.A03 J1.A04 J1.A07 J1.A13 J1.A15 J1.A22 J1.A24 J1.A27 J1.A30 J1.B03 J1.B04 J1.B05 J1.B06 J1.B15 J1.B22 J1.B27 J1.B30 J1.C03 J1.C04 J1.C11 J1.C17 J1.C23 J1.C25 J1.C26 J1.C27 J1.D03 J1.D04 J1.D12 J1.D15 J1.D18 J1.D21 J1.D24 J1.D27 J1.D28 ; also sheet 1,2,3,4,5,6,7,9,10,11
Unconnected: J1.A05 J1.A06 J1.A08 J1.A09 J1.A10 J1.A11 J1.A12 J1.A14 J1.A16 J1.A17 J1.A18 J1.A19 J1.A20 J1.A21 J1.A23 J1.A25 J1.A26 J1.A28 J1.A29 J1.B07 J1.B08 J1.B09 J1.B10 J1.B11 J1.B12 J1.B13 J1.B14 J1.B16 J1.B17 J1.B18 J1.B19 J1.B20 J1.B21 J1.B23 J1.B24 J1.B25 J1.B26 J1.B28 J1.B29 J1.C05 J1.C06 J1.C07 J1.C08 J1.C09 J1.C10 J1.C12 J1.C13 J1.C14 J1.C15 J1.C16 J1.C18 J1.C19 J1.C20 J1.C21 J1.C22 J1.C24 J1.C28 J1.C29 J1.C30 J1.D05 J1.D06 J1.D07 J1.D08 J1.D09 J1.D10 J1.D11 J1.D13 J1.D14 J1.D16 J1.D17 J1.D19 J1.D20 J1.D22 J1.D23 J1.D25 J1.D26 J1.D29 J1.D30

## Sheet 9 of 11: VOXL2 Connection [J3]
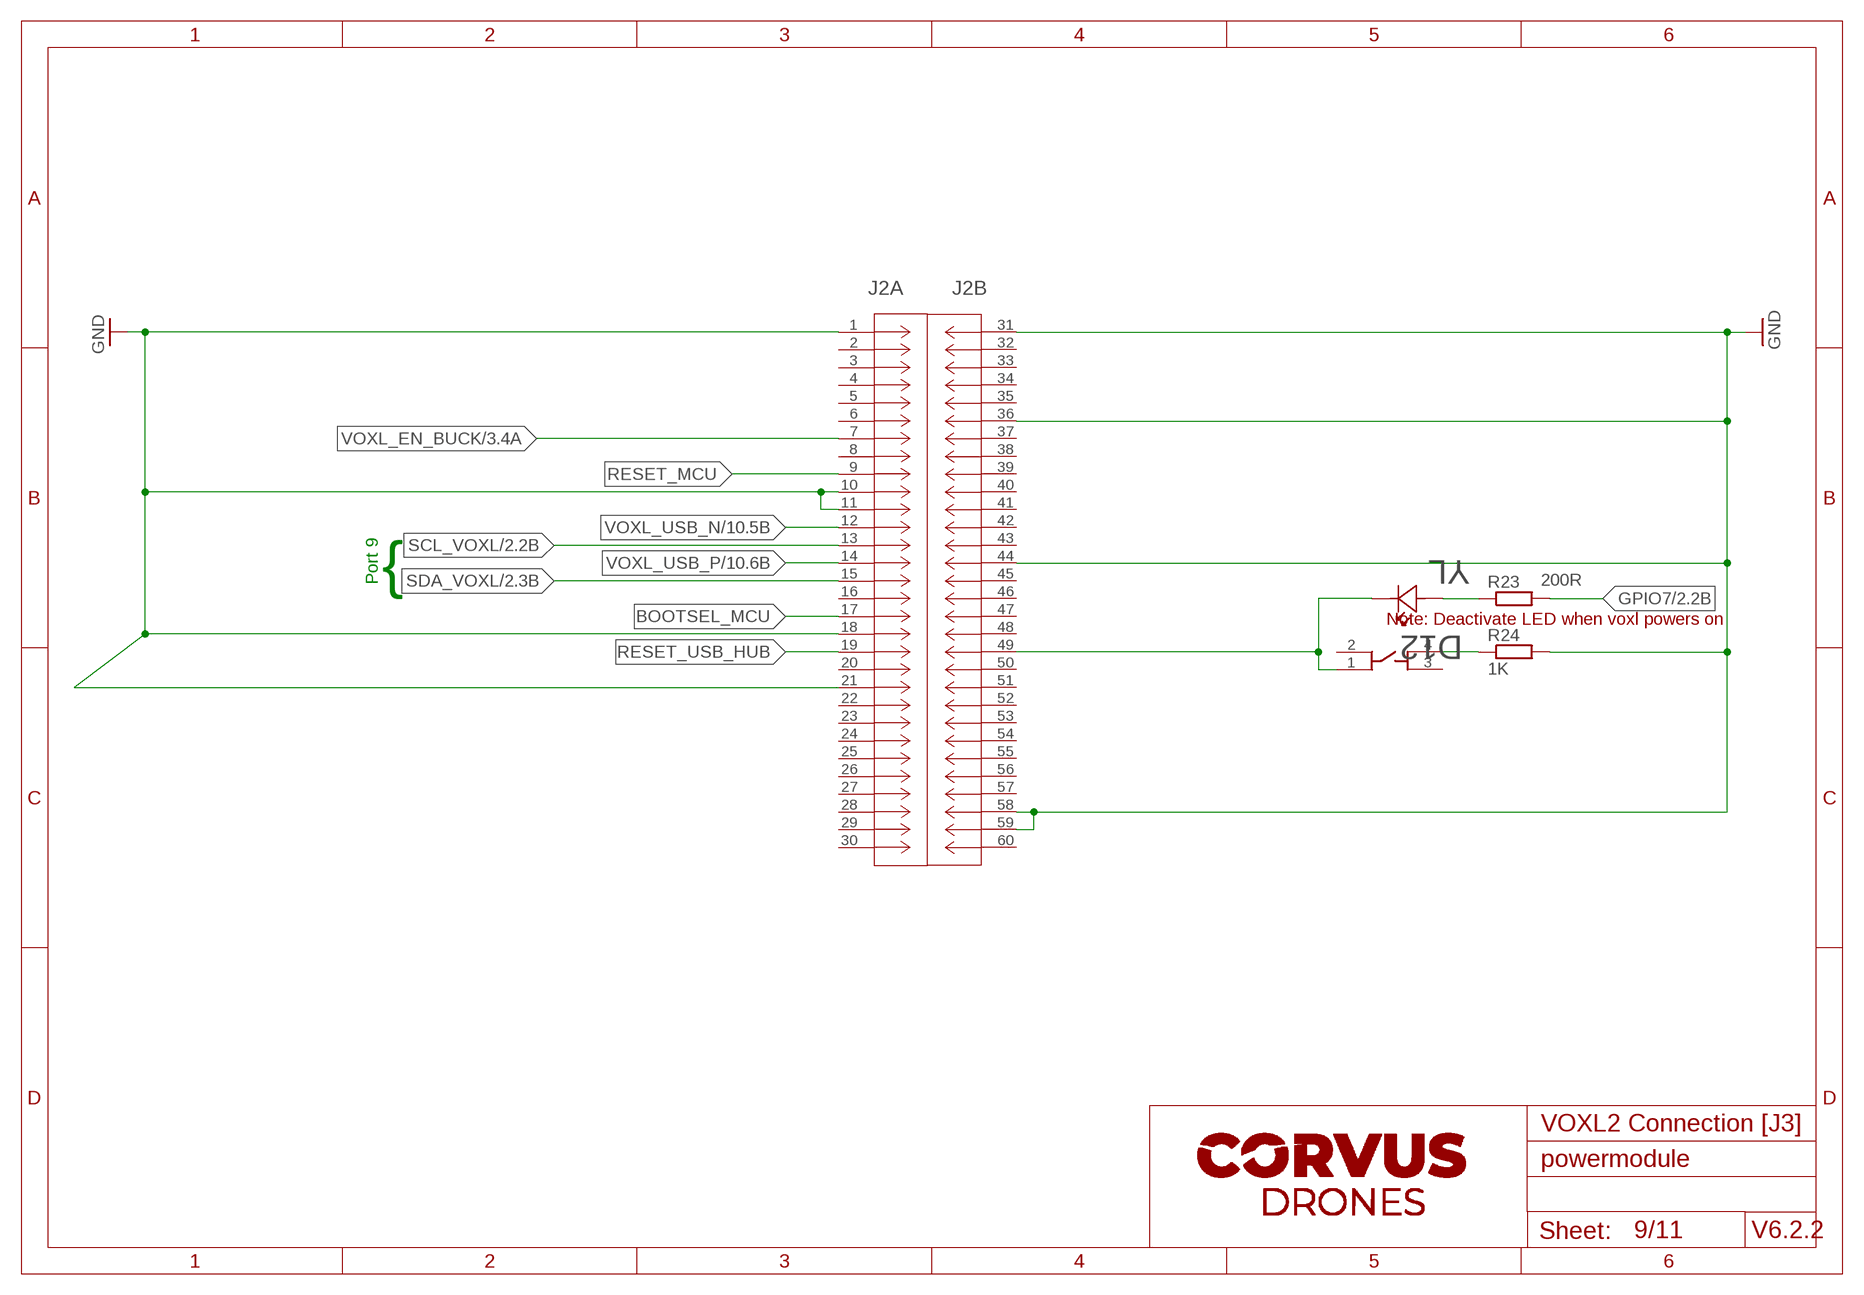
[diagram p8: schematic, sheet 9]

### Parts
D12  YL  LED_0805_YELLOW  [LED_0805]
J2  QTH-030-01-L-D-ACONN_QTH-030-02-L-D-A-K-FR_S00  [CONN_QTH-030-02-L-D-A-K-FR_S00]
R23  200R  R_0603_200R  [R0603]
R24  1K  R_0603_1K  [R0603]
SW2  FASTBOOT  EVQ-P7J01P  [EVQ-P7J01P]

### Nets
BOOTSEL_MCU: J2.17
GND: J2.1 J2.10 J2.11 J2.18 J2.21 J2.31 J2.36 J2.44 J2.58 J2.59 R24.2 ; also sheet 1,2,3,4,5,6,7,8,10,11
GPIO7: R23.2 ; also sheet 2
N$7: R24.1 SW2.4
N$9: D12.C J2.49 SW2.1
N$12: D12.A R23.1
RESET_MCU: J2.9
RESET_USB_HUB: J2.19
SCL_VOXL: J2.13 ; also sheet 2
SDA_VOXL: J2.15 ; also sheet 2
VOXL_EN_BUCK: J2.7 ; also sheet 3
VOXL_USB_N: J2.12 ; also sheet 10
VOXL_USB_P: J2.14 ; also sheet 10
Unconnected: J2.2 J2.3 J2.4 J2.5 J2.6 J2.8 J2.16 J2.20 J2.22 J2.23 J2.24 J2.25 J2.26 J2.27 J2.28 J2.29 J2.30 J2.32 J2.33 J2.34 J2.35 J2.37 J2.38 J2.39 J2.40 J2.41 J2.42 J2.43 J2.45 J2.46 J2.47 J2.48 J2.50 J2.51 J2.52 J2.53 J2.54 J2.55 J2.56 J2.57 J2.60 SW2.2 SW2.3

### Notes on the sheet
- Port 9 | {
- Note: Deactivate LED when voxl powers on

## Sheet 10 of 11: USB switch
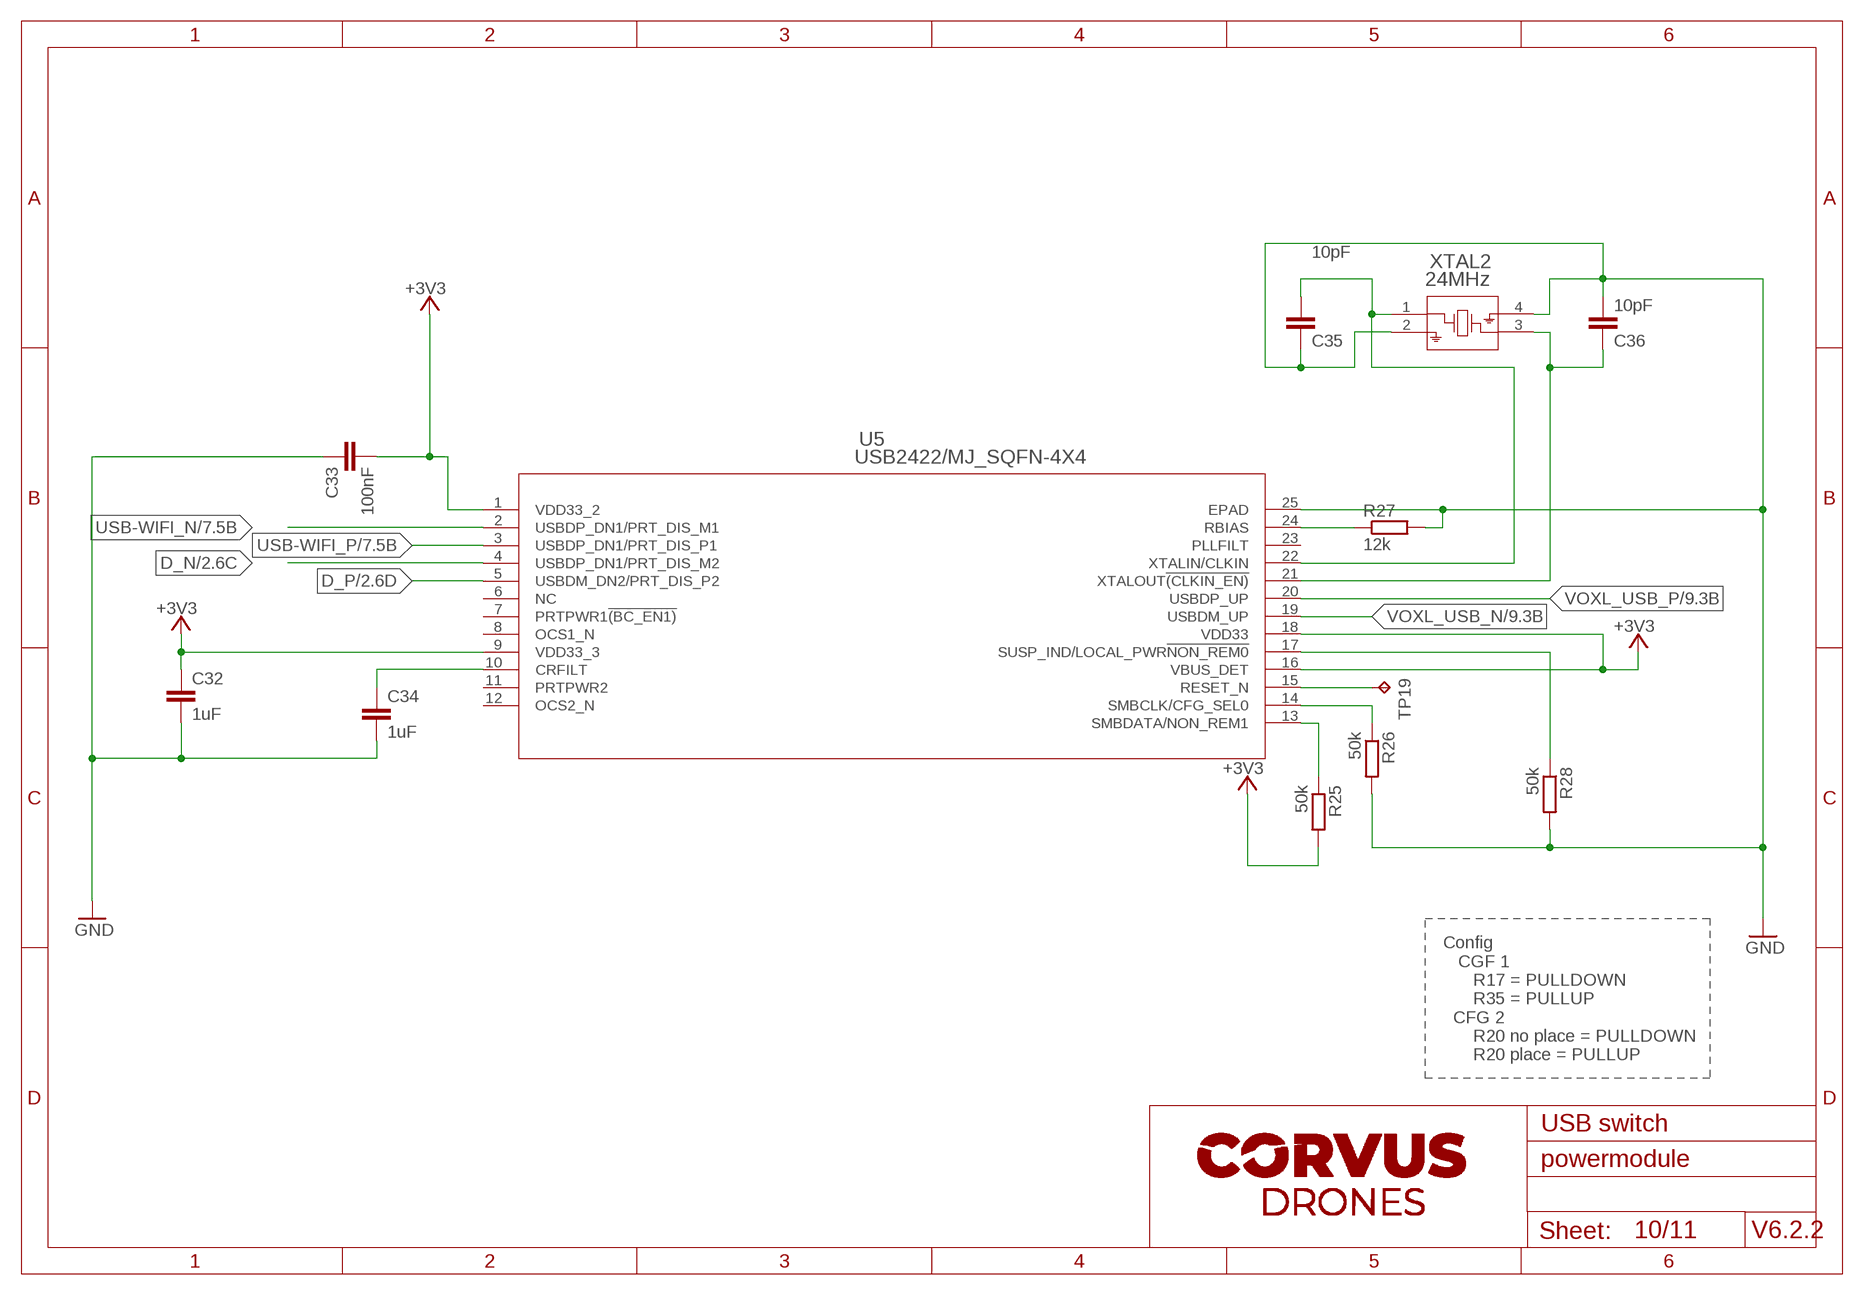
[diagram p9: schematic, sheet 10]

### Parts
C32  1uF  C_0603_1U  [C0603]
C33  100nF  C_0603_100N  [C0603]
C34  1uF  C_0603_1U  [C0603]
C35  10pF  C_0603_10P  [C0603]
C36  10pF  C_0603_10P  [C0603]
R25  50k  R_0603_50K  [R0603]
R26  50k  R_0603_50K  [R0603]
R27  12k  R_0603_12K  [R0603]
R28  50k  R_0603_50K  [R0603]
TP19  TPTP11R  [TP11R]
U5  USB2422/MJ_SQFN-4X4  [SQFN24_4X4]
XTAL2  24MHz  MCSJK-7U-12.00-10-10-80-B-10_24MHZSMD3225_3.2X2.5X0.7_MTC-L  [SMD3225_3.2X2.5X0.7_MTC-L]

### Nets
+3V3: C32.1 C33.1 R25.2 U5.1(VDD33_2) U5.9(VDD33_3) U5.16(VBUS_DET) U5.18(VDD33) ; also sheet 1,2,4,6,7
D_N [dif pairs]: U5.4(USBDP_DN1/PRT_DIS_M2) ; also sheet 2
D_P [dif pairs]: U5.5(USBDM_DN2/PRT_DIS_P2) ; also sheet 2
GND: C32.2 C33.2 C34.2 C35.2 C36.1 R26.2 R27.2 R28.2 U5.25(EPAD) XTAL2.2 XTAL2.4 ; also sheet 1,2,3,4,5,6,7,8,9,11
HUB_RESET: TP19.TP U5.15(RESET_N)
N$17: R27.1 U5.24(RBIAS)
N$20: C36.2 U5.21(XTALOUT!(CLKIN_EN)) XTAL2.3
N$23: C35.1 U5.22(XTALIN/CLKIN) XTAL2.1
N$26: R26.1 U5.14(SMBCLK/CFG_SEL0)
N$28: R25.1 U5.13(SMBDATA/NON_REM1)
N$33: R28.1 U5.17(SUSP_IND/LOCAL_PWR!NON_REM0)
N$34: C34.1 U5.10(CRFILT)
USB-WIFI_N: U5.2(USBDP_DN1/PRT_DIS_M1) ; also sheet 7
USB-WIFI_P: U5.3(USBDP_DN1/PRT_DIS_P1) ; also sheet 7
VOXL_USB_N: U5.19(USBDM_UP) ; also sheet 9
VOXL_USB_P: U5.20(USBDP_UP) ; also sheet 9
Unconnected: U5.6(NC) U5.7(PRTPWR1!(BC_EN1)) U5.8(OCS1_N) U5.12(OCS2_N) U5.23(PLLFILT)

### Notes on the sheet
- Config
     CGF 1
        R17 = PULLDOWN 
        R35 = PULLUP
    CFG 2
        R20 no place = PULLDOWN
        R20 place = PULLUP

## Sheet 11 of 11: MISC
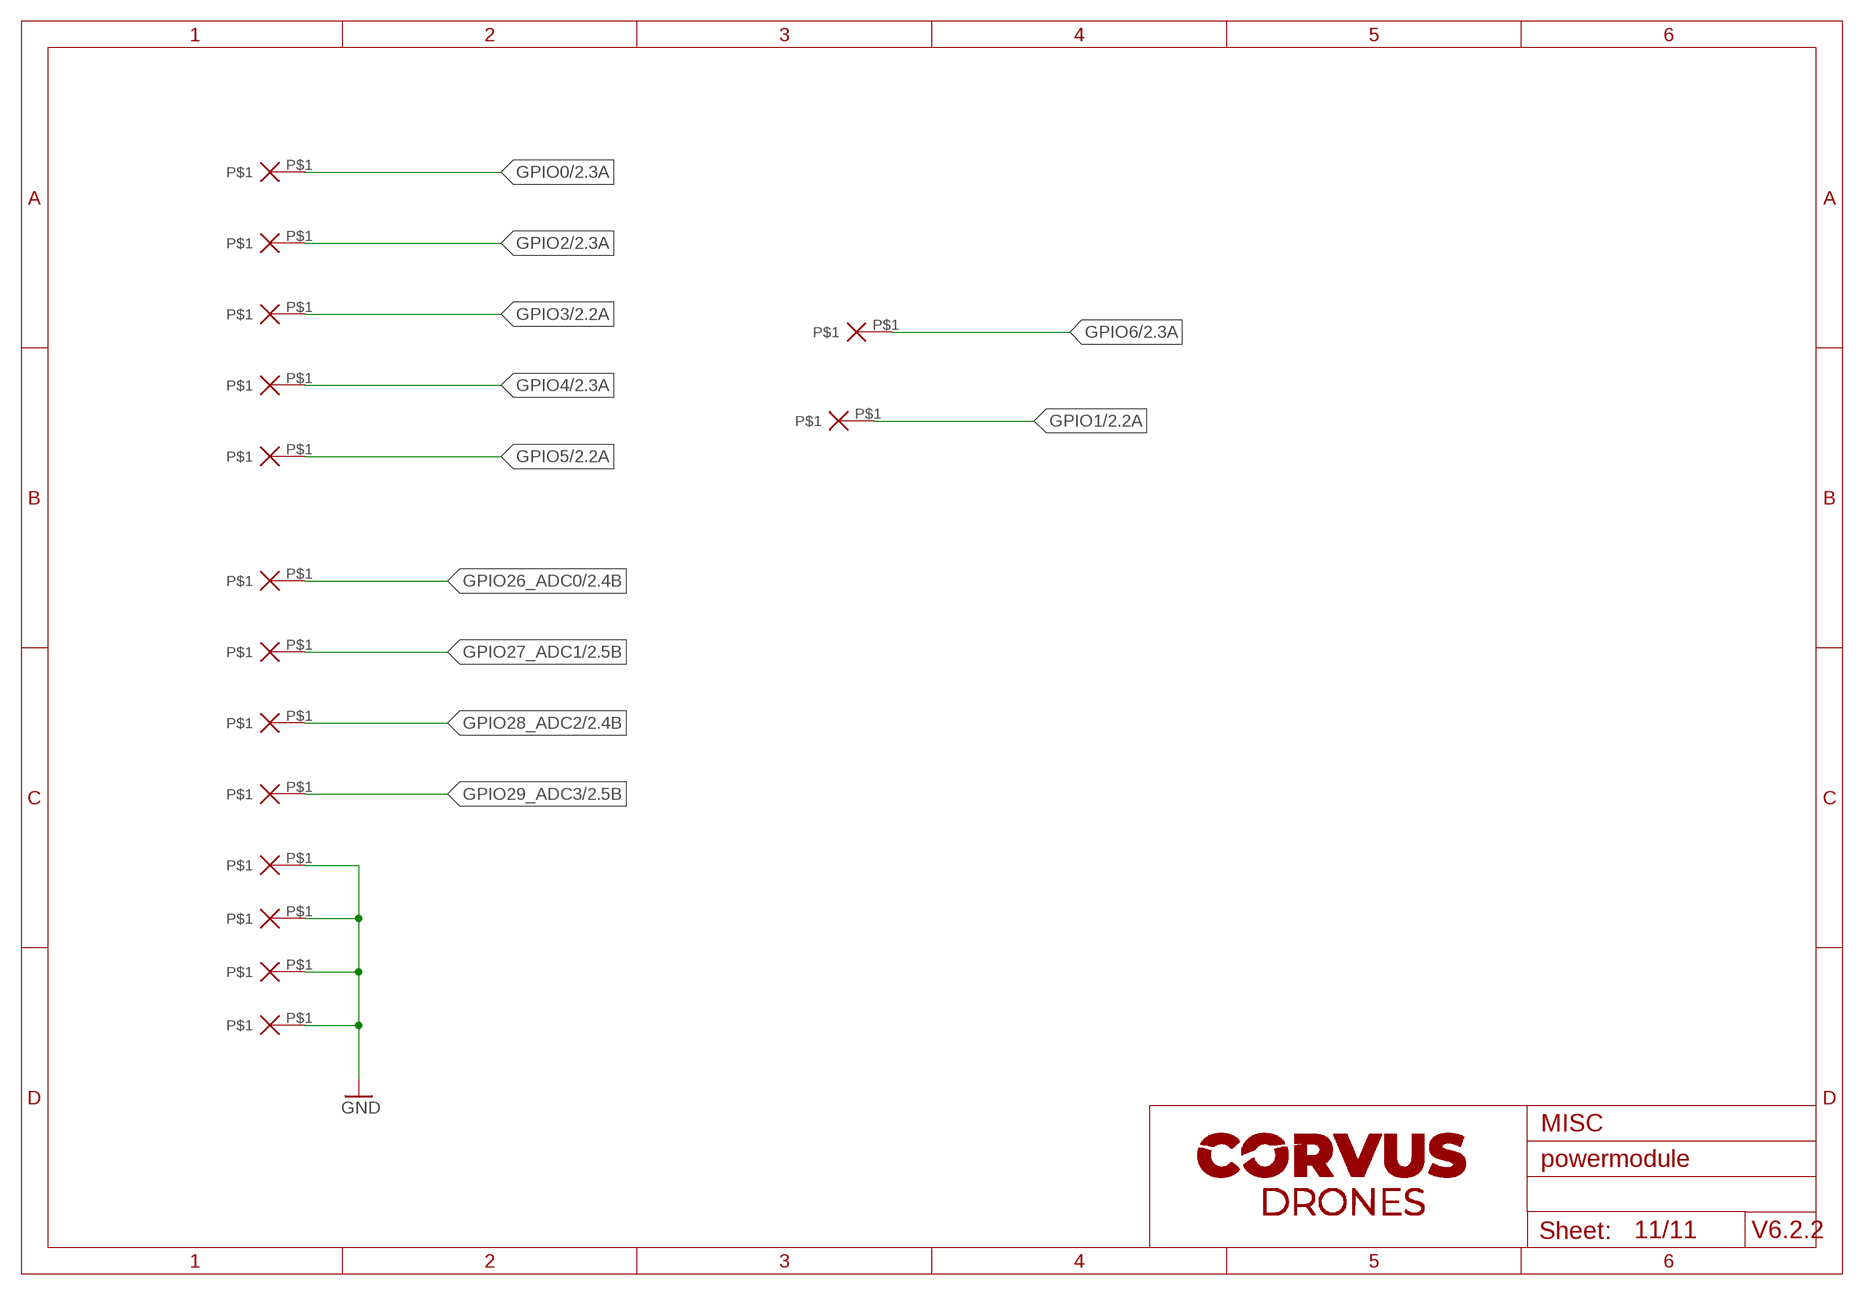
[diagram p10: schematic, sheet 11]

### Parts
H1  SMT_SPACER_5MMX2.5M  [SMT_SPACER_5MMX2.5M]
H2  SMT_SPACER_5MMX2.5M  [SMT_SPACER_5MMX2.5M]
H3  SMT_SPACER_5MMX2.5M  [SMT_SPACER_5MMX2.5M]
H4  SMT_SPACER_5MMX2.5M  [SMT_SPACER_5MMX2.5M]
XP1  SMT-PAD_R1-5MM  [SMT-PAD_R1-5MM]
XP2  SMT-PAD_R1-5MM  [SMT-PAD_R1-5MM]
XP3  SMT-PAD_R1-5MM  [SMT-PAD_R1-5MM]
XP4  SMT-PAD_R1-5MM  [SMT-PAD_R1-5MM]
XP5  SMT-PAD_R1-5MM  [SMT-PAD_R1-5MM]
XP6  SMT-PAD_R1-5MM  [SMT-PAD_R1-5MM]
XP7  SMT-PAD_R1-5MM  [SMT-PAD_R1-5MM]
XP8  SMT-PAD_R1-5MM  [SMT-PAD_R1-5MM]
XP9  SMT-PAD_R1-5MM  [SMT-PAD_R1-5MM]
XP10  SMT-PAD_R1-5MM  [SMT-PAD_R1-5MM]
XP11  SMT-PAD_R1-5MM  [SMT-PAD_R1-5MM]

### Nets
GND: H1.P$1 H2.P$1 H3.P$1 H4.P$1 ; also sheet 1,2,3,4,5,6,7,8,9,10
GPIO0: XP1.P$1 ; also sheet 2
GPIO1: XP11.P$1 ; also sheet 2
GPIO2: XP2.P$1 ; also sheet 2
GPIO3: XP3.P$1 ; also sheet 2
GPIO4: XP4.P$1 ; also sheet 2
GPIO5: XP5.P$1 ; also sheet 2
GPIO6: XP10.P$1 ; also sheet 2
GPIO26_ADC0: XP6.P$1 ; also sheet 2
GPIO27_ADC1: XP7.P$1 ; also sheet 2
GPIO28_ADC2: XP8.P$1 ; also sheet 2
GPIO29_ADC3: XP9.P$1 ; also sheet 2

## Power pins joined to a net without a drawn wire
PRTPWR2: U5.11(PRTPWR2)

## Library data of the parts
C1 C3 C5 C6 C8 C12-C16 C19 C20 C26 C33 = corvus_RC:C_0603; FARNELL: 2320813
C2 C4 C7 C11 C27 = corvus_RC:C_0603; FARNELL: 3013428
C9 C10 C35 C36 = corvus_RC:C_0603; FARNELL: 3013438
C17 C18 = corvus_RC:C_0603; FARNELL: 2611921
C21 C22 C28-C31 = corvus_RC:C_1206; FARNELL: 2320911
C23 C24 = corvus_RC:C_0805; FARNELL: 3013452
C25 = corvus_RC:C_0603; FARNELL: 3013399
C32 C34 = corvus_RC:C_0603; FARNELL: 3013421
D1 D12 = corvus_parts:LED_0805; FARNELL: 1581241
D2-D4 D7 D9 = corvus_parts:1N4148WS; FARNELL: 2675148
D5 D6 = corvus_parts:MMSD4148T1G; FARNELL: 9556079
D10 = corvus_parts:LED_0805; FARNELL: 1581242
D11 = corvus_parts:LED_0805; FARNELL: 3587634
GND_SER X3 X4 = corvus_holes:TH-0.75/0.6
H1-H4 = corvus_holes:SMT_SPACER_5MMX2.5M; DIGIKEY: 732-7095-2-ND; FARNELL: 2497604; MOUSSER: 710-9774050151R
J1 = corvus:ADM6-30-01.5-L-4-2-A-TR; FARNELL: 3462772
J2 = corvus:QTH-030-01-L-D-A; FARNELL: 2856183, 3665437
L1 = corvus_parts:VLS3012HBX-3R3M
L2 = corvus_parts:HA72L-06301R5LFTR; FARNELL: 2932065
Q1 Q3 = corvus_parts:2N7002,215; FARNELL: 3226401
Q2 Q4 = corvus_parts:SI2301CDS-T1-GE3; DIGIKEY: SI2301CDS-T1-GE3CT-ND
R1 R3 R24 = corvus_RC:R_0603; FARNELL: 3399571
R2 R8 R15 R17 = corvus_RC:R_0603; FARNELL: 2074170
R4 R5 R19 R22 R23 = corvus_RC:R_0603; FARNELL: 2447292
R6 R7 = corvus_RC:R_0603; FARNELL: 3399577
R9 R12 = corvus_RC:R_0603; FARNELL: 2447385
R10 R11 R13 R14 R16 R20 R21 = corvus_RC:R_0603; FARNELL: 2447226
R18 = corvus_RC:R_0603; FARNELL: 2447343
R25 R26 R28 = corvus_RC:R_0603; FARNELL: 3782229
R27 = corvus_RC:R_0603; FARNELL: 2331741
SW1 SW2 = corvus_parts:EVQ-P7J01P; DIGIKEY: P16767TR-ND; FARNELL: 2860918; MOUSSER: 667-EVQP7J01P
SWCLK SWDIO TP4-TP9 TP11-TP17 TP19 = corvus_holes:TP
U1 = corvus_chips:W25Q16JVUXIQ
U2 = corvus_chips:RP2040TR7; DIGIKEY: 2648-SC0914(13)TR-ND; FARNELL: 3766082; LCSC: C2040; MOUSSER: 358-SC09147
U3 = corvus_chips:TPS563201DDCR; DIGIKEY: 296-47238-1-ND
U4 = corvus_chips:RT7291AGQUF; DIGIKEY: 1028-RT7291AGQUFTR-ND; FARNELL: -; MOUSSER: -
U5 = corvus_chips:USB2422/MJ
W1 = corvus_parts:WIFI-RTL8188EUS
X2 = corvus_parts:FH12-30S-0.5S; FARNELL: 1324555
XP1-XP11 = corvus_holes:SMT-PAD_R1-5MM
XTAL1 = corvus_parts:MCSJK-7U-12.00-10-10-80-B-10; FARNELL: 2853916
XTAL2 = corvus_parts:MCSJK-7U-12.00-10-10-80-B-10; FARNELL: 2853960